# EAGLE schematic control (EAGLE 8.1.1)
Control Board
REVISION: v2.1; TEAM: RoboCup SSL

## Sheet 1 of 5: Microcontroller
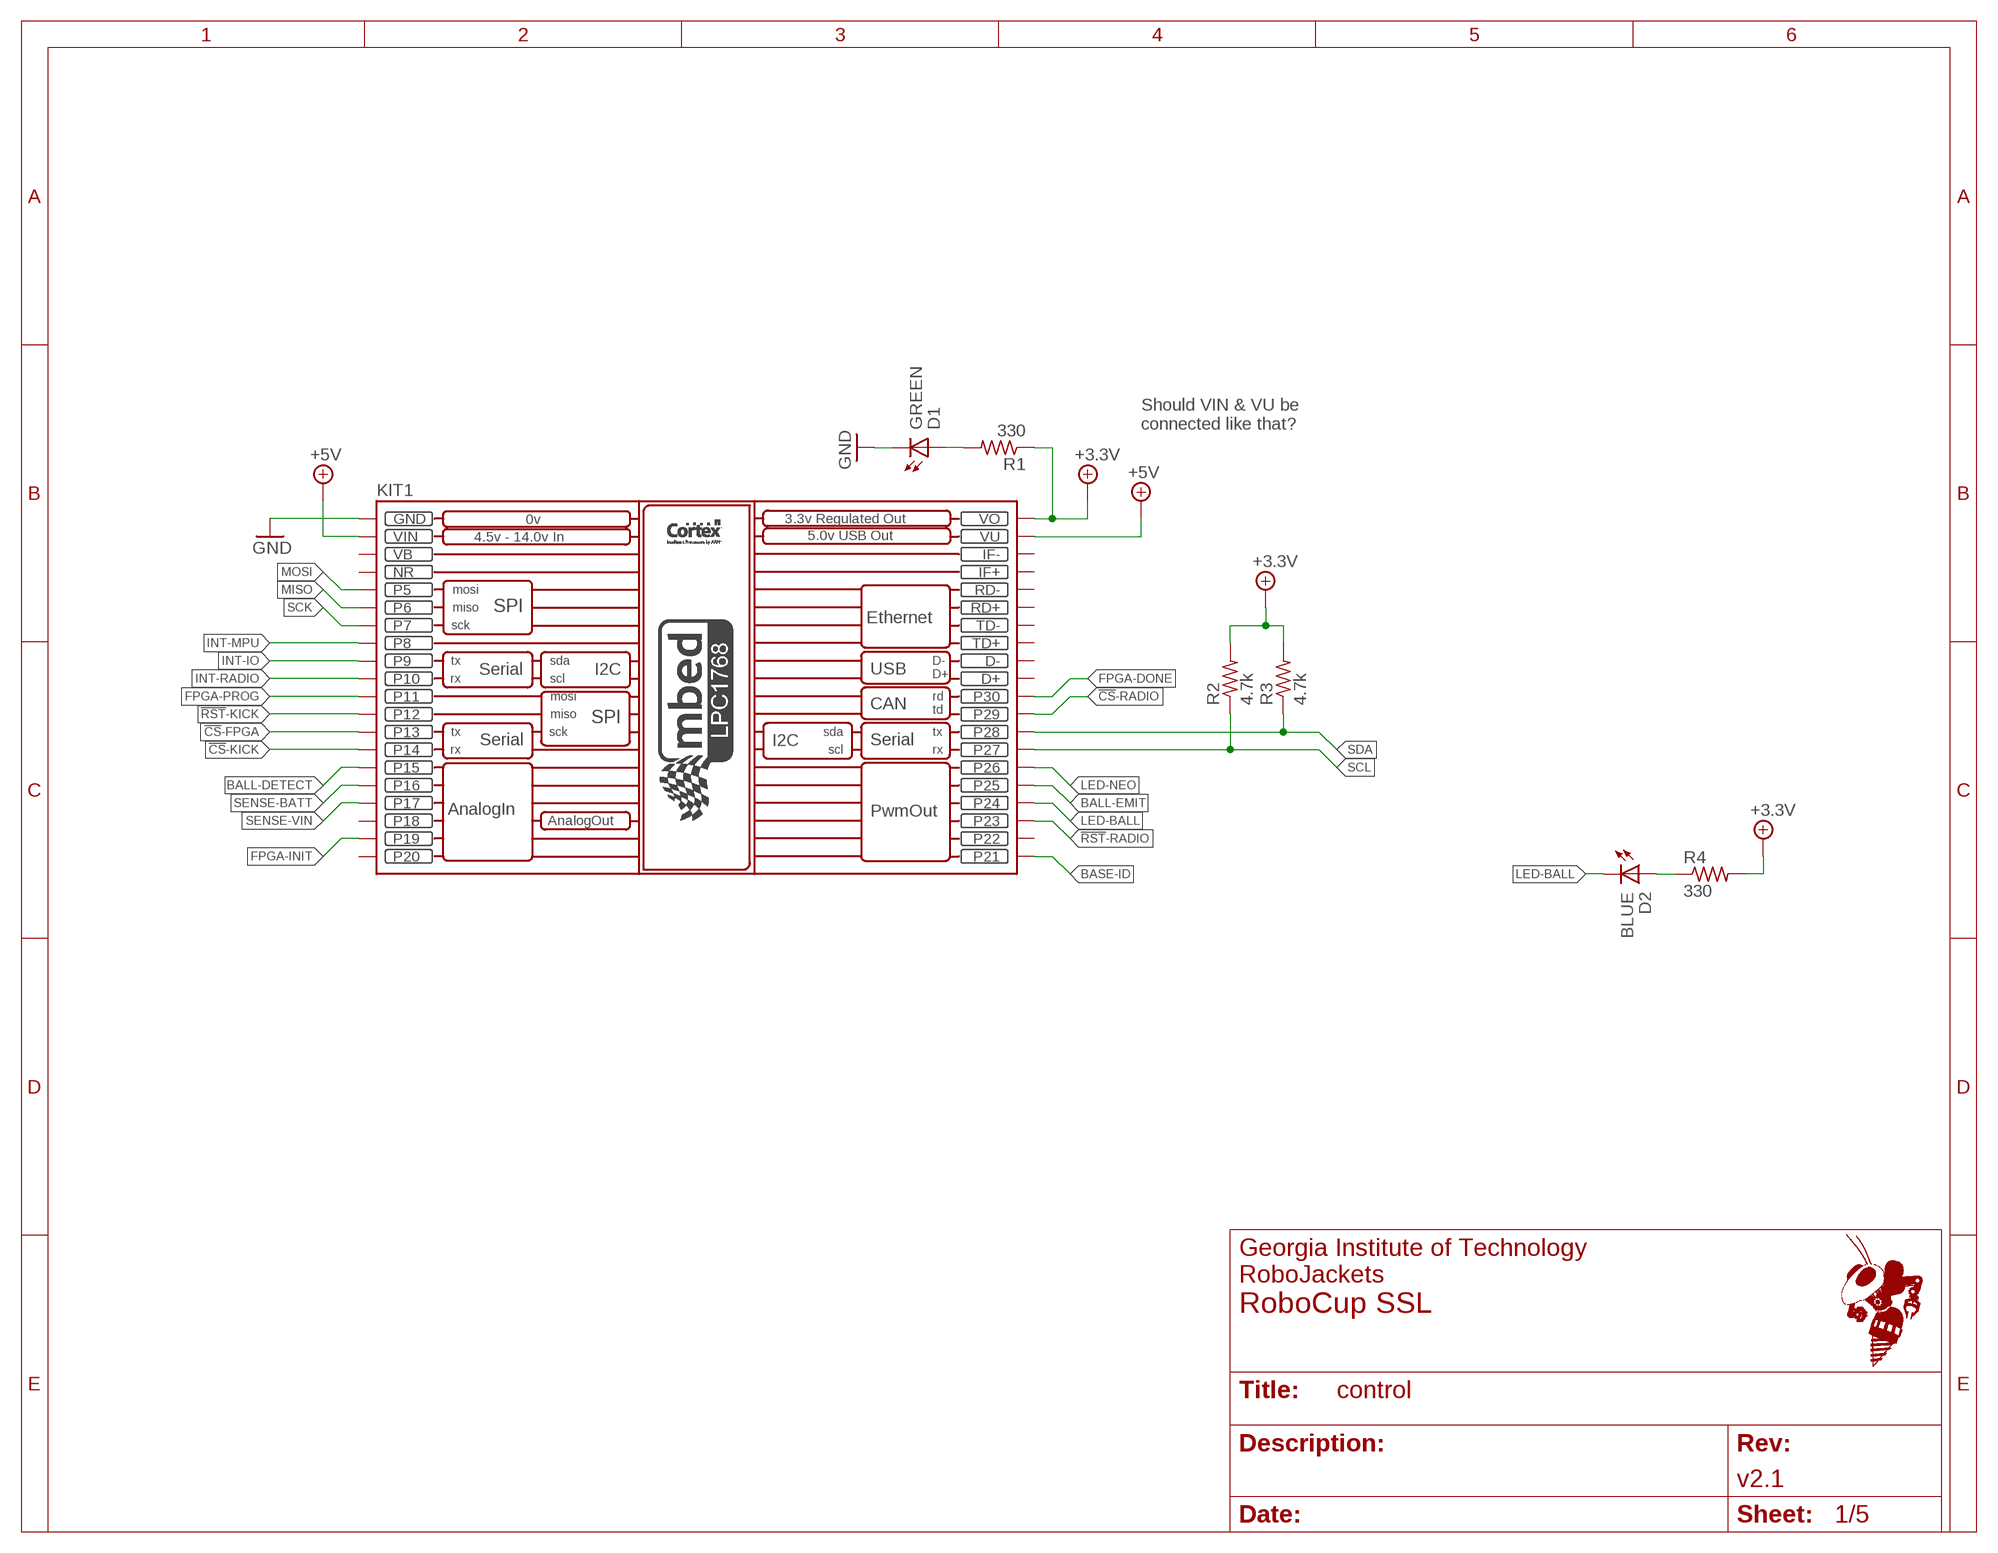
[diagram p0: schematic, sheet 1]
FRAME1 (FRAME_A_L): SCH_DESC: Microcontroller

### Parts
D1  GREEN  LED-SMD-GREEN  [CHIP-LED0603]
D2  BLUE  LED-SMD-BLUE  [CHIP-LED0603]
KIT1  MBED_NXP_LPC1768  [MBED-KIT]
R1  330  R-US_R0603  [R0603]
R2  4.7k  R-US_R0603  [R0603]
R3  4.7k  R-US_R0603  [R0603]
R4  330  R-US_R0603  [R0603]

### Nets
!CS!-FPGA: KIT1.P$13(P13) ; also sheet 2
!CS!-KICK: KIT1.P$14(P14) ; also sheet 3
!CS!-RADIO: KIT1.P$29(P29) ; also sheet 3
!RST!-KICK: KIT1.P$12(P12) ; also sheet 3
!RST!-RADIO: KIT1.P$23(P23) ; also sheet 3
+3.3V: KIT1.VOUT(VO) R1.1 R2.2 R3.2 R4.2 ; also sheet 2,3,4,5
+3.3V-LED: D1.A R1.2
+5V: KIT1.VIN KIT1.VU ; also sheet 3,4,5
BALL-DETECT: KIT1.P$15(P15) ; also sheet 3
BALL-EMIT: KIT1.P$25(P25) ; also sheet 3
BASE-ID: KIT1.P$21(P21)
FPGA-DONE: KIT1.P$30(P30) ; also sheet 2
FPGA-INIT: KIT1.P$19(P19) ; also sheet 2
FPGA-PROG: KIT1.P$11(P11) ; also sheet 2
GND: D1.C(K) KIT1.GND ; also sheet 2,3,4,5
INT-IO: KIT1.P$9(P9) ; also sheet 3
INT-MPU: KIT1.P$8(P8) ; also sheet 3
INT-RADIO: KIT1.P$10(P10) ; also sheet 3
LED-BALL: D2.C(K) KIT1.P$24(P24)
LED-BALL-PRE: D2.A R4.1
LED-NEO: KIT1.P$26(P26) ; also sheet 3
MISO: KIT1.P$6(P6) ; also sheet 2,3
MOSI: KIT1.P$5(P5) ; also sheet 2,3
SCK: KIT1.P$7(P7) ; also sheet 2,3
SCL: KIT1.P$27(P27) R2.1 ; also sheet 3
SDA: KIT1.P$28(P28) R3.1 ; also sheet 3
SENSE-BATT: KIT1.P$16(P16) ; also sheet 3
SENSE-VIN: KIT1.P$17(P17) ; also sheet 3
Unconnected: KIT1.D+ KIT1.D- KIT1.IF+ KIT1.IF- KIT1.NR KIT1.P$18(P18) KIT1.P$20(P20) KIT1.P$22(P22) KIT1.RD+ KIT1.RD- KIT1.TD+ KIT1.TD-

### Notes on the sheet
- Should VIN & VU be
  connected like that?

## Sheet 2 of 5: FPGA
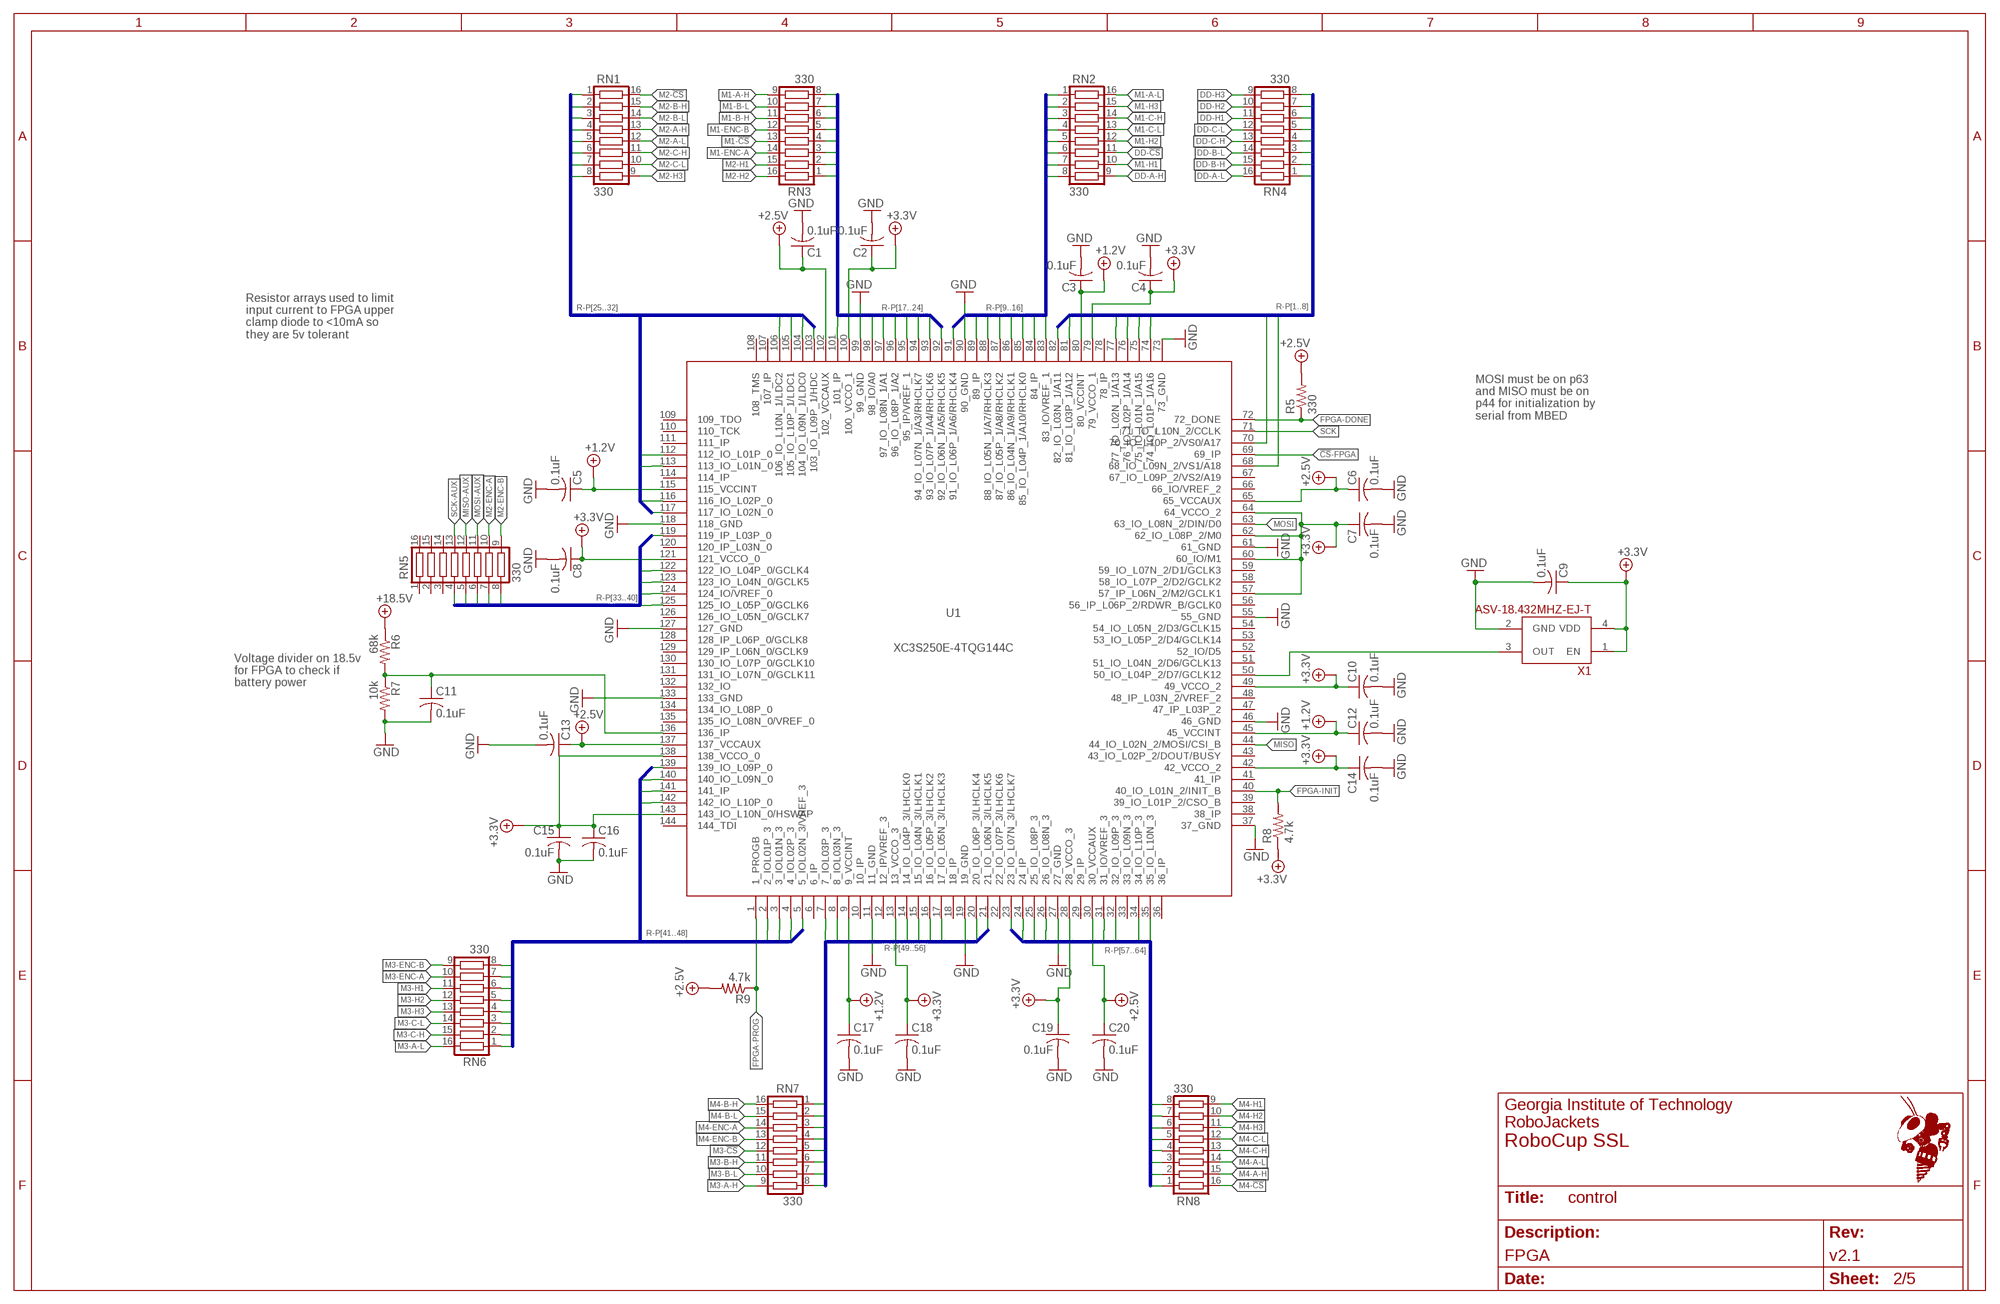
[diagram p1: schematic, sheet 2]
FRAME2 (FRAME_B_L): SCH_DESC: FPGA

### Parts
C1  0.1uF  C-USC0603  [C0603]
C2  0.1uF  C-USC0603  [C0603]
C3  0.1uF  C-USC0603  [C0603]
C4  0.1uF  C-USC0603  [C0603]
C5  0.1uF  C-USC0603  [C0603]
C6  0.1uF  C-USC0603  [C0603]
C7  0.1uF  C-USC0603  [C0603]
C8  0.1uF  C-USC0603  [C0603]
C9  0.1uF  C-USC0603  [C0603]
C10  0.1uF  C-USC0603  [C0603]
C11  0.1uF  C-USC0603  [C0603]
C12  0.1uF  C-USC0603  [C0603]
C13  0.1uF  C-USC0603  [C0603]
C14  0.1uF  C-USC0603  [C0603]
C15  0.1uF  C-USC0603  [C0603]
C16  0.1uF  C-USC0603  [C0603]
C17  0.1uF  C-USC0603  [C0603]
C18  0.1uF  C-USC0603  [C0603]
C19  0.1uF  C-USC0603  [C0603]
C20  0.1uF  C-USC0603  [C0603]
R5  330  R-US_R0603  [R0603]
R6  68k  R-US_R0603  [R0603]
R7  10k  R-US_R0603  [R0603]
R8  4.7k  R-US_R0603  [R0603]
R9  4.7k  R-US_R0603  [R0603]
RN1  330  RA-8  [RA-8_2506]
RN2  330  RA-8  [RA-8_2506]
RN3  330  RA-8  [RA-8_2506]
RN4  330  RA-8  [RA-8_2506]
RN5  330  RA-8  [RA-8_2506]
RN6  330  RA-8  [RA-8_2506]
RN7  330  RA-8  [RA-8_2506]
RN8  330  RA-8  [RA-8_2506]
U1  XC3S250E-4TQG144C  [TQFP144]
X1  ASV-18.432MHZ-EJ-T  [ASV]

### Nets
!CS!-FPGA: U1.69(69_IP) ; also sheet 1
+1.2V: C3.1 C5.1 C12.1 C17.1 U1.9(9_VCCINT) U1.45(45_VCCINT) U1.80(80_VCCINT) U1.115(115_VCCINT) ; also sheet 4
+2.5V: C1.1 C6.1 C13.1 C20.1 R5.2 R9.2 U1.30(30_VCCAUX) U1.65(65_VCCAUX) U1.102(102_VCCAUX) U1.137(137_VCCAUX) ; also sheet 4
+3.3V: C2.1 C4.1 C7.1 C8.1 C9.1 C10.1 C14.1 C15.1 C16.1 C18.1 C19.1 R8.1 U1.13(13_VCCO_3) U1.28(28_VCCO_3) U1.42(42_VCCO_2) U1.49(49_VCCO_2) U1.57(57_IP_L06N_2/M2/GCLK1) U1.60(60_IO/M1) U1.62(62_IO_L08P_2/M0) U1.64(64_VCCO_2) U1.79(79_VCCO_1) U1.100(100_VCCO_1) U1.121(121_VCCO_0) U1.138(138_VCCO_0) U1.143(143_IO_L10N_0/HSWAP) X1.1(EN) X1.4(VDD) ; also sheet 1,3,4,5
+18.5V: R6.1 ; also sheet 3,4,5
BATT-FPGA: C11.1 R6.2 R7.1 U1.136(136_IP)
DD-!CS: RN2.11 ; also sheet 5
DD-A-H: RN2.9 ; also sheet 5
DD-A-L: RN4.16 ; also sheet 5
DD-B-H: RN4.15 ; also sheet 5
DD-B-L: RN4.14 ; also sheet 5
DD-C-H: RN4.13 ; also sheet 5
DD-C-L: RN4.12 ; also sheet 5
DD-H1: RN4.11 ; also sheet 5
DD-H2: RN4.10 ; also sheet 5
DD-H3: RN4.9 ; also sheet 5
FPGA-CLK: U1.50(50_IO_L04P_2/D7/GCLK12) X1.3(OUT)
FPGA-DONE: R5.1 U1.72(72_DONE) ; also sheet 1
FPGA-INIT: R8.2 U1.40(40_IO_L01N_2/INIT_B) ; also sheet 1
FPGA-PROG: R9.1 U1.1(1_PROGB) ; also sheet 1
GND: C1.2 C2.2 C3.2 C4.2 C5.2 C6.2 C7.2 C8.2 C9.2 C10.2 C11.2 C12.2 C13.2 C14.2 C15.2 C16.2 C17.2 C18.2 C19.2 C20.2 R7.2 U1.11(11_GND) U1.19(19_GND) U1.27(27_GND) U1.37(37_GND) U1.46(46_GND) U1.55(55_GND) U1.61(61_GND) U1.73(73_GND) U1.90(90_GND) U1.99(99_GND) U1.118(118_GND) U1.127(127_GND) U1.133(133_GND) X1.2(GND) ; also sheet 1,3,4,5
M1-!CS: RN3.13 ; also sheet 5
M1-A-H: RN3.9 ; also sheet 5
M1-A-L: RN2.16 ; also sheet 5
M1-B-H: RN3.11 ; also sheet 5
M1-B-L: RN3.10 ; also sheet 5
M1-C-H: RN2.14 ; also sheet 5
M1-C-L: RN2.13 ; also sheet 5
M1-ENC-A: RN3.14 ; also sheet 5
M1-ENC-B: RN3.12 ; also sheet 5
M1-H1: RN2.10 ; also sheet 5
M1-H2: RN2.12 ; also sheet 5
M1-H3: RN2.15 ; also sheet 5
M2-!CS: RN1.16 ; also sheet 5
M2-A-H: RN1.13 ; also sheet 5
M2-A-L: RN1.12 ; also sheet 5
M2-B-H: RN1.15 ; also sheet 5
M2-B-L: RN1.14 ; also sheet 5
M2-C-H: RN1.11 ; also sheet 5
M2-C-L: RN1.10 ; also sheet 5
M2-ENC-A: RN5.10 ; also sheet 5
M2-ENC-B: RN5.9 ; also sheet 5
M2-H1: RN3.15 ; also sheet 5
M2-H2: RN3.16 ; also sheet 5
M2-H3: RN1.9 ; also sheet 5
M3-!CS: RN7.12 ; also sheet 5
M3-A-H: RN7.9 ; also sheet 5
M3-A-L: RN6.16 ; also sheet 5
M3-B-H: RN7.11 ; also sheet 5
M3-B-L: RN7.10 ; also sheet 5
M3-C-H: RN6.15 ; also sheet 5
M3-C-L: RN6.14 ; also sheet 5
M3-ENC-A: RN6.10 ; also sheet 5
M3-ENC-B: RN6.9 ; also sheet 5
M3-H1: RN6.11 ; also sheet 5
M3-H2: RN6.12 ; also sheet 5
M3-H3: RN6.13 ; also sheet 5
M4-!CS: RN8.16 ; also sheet 5
M4-A-H: RN8.15 ; also sheet 5
M4-A-L: RN8.14 ; also sheet 5
M4-B-H: RN7.16 ; also sheet 5
M4-B-L: RN7.15 ; also sheet 5
M4-C-H: RN8.13 ; also sheet 5
M4-C-L: RN8.12 ; also sheet 5
M4-ENC-A: RN7.14 ; also sheet 5
M4-ENC-B: RN7.13 ; also sheet 5
M4-H1: RN8.9 ; also sheet 5
M4-H2: RN8.10 ; also sheet 5
M4-H3: RN8.11 ; also sheet 5
MISO: U1.44(44_IO_L02N_2/MOSI/CSI_B) ; also sheet 1,3
MISO-AUX: RN5.12 ; also sheet 5
MOSI: U1.63(63_IO_L08N_2/DIN/D0) ; also sheet 1,3
MOSI-AUX: RN5.11 ; also sheet 5
R-P1: RN4.1 U1.82(82_IO_L03N_1/A11)
R-P2: RN4.2 U1.81(81_IO_L03P_1/A12)
R-P3: RN4.3 U1.77(77_IO_L02N_1/A13)
R-P4: RN4.4 U1.76(76_IO_L02P_1/A14)
R-P5: RN4.5 U1.75(75_IO_L01N_1/A15)
R-P6: RN4.6 U1.74(74_IO_L01P_1/A16)
R-P7: RN4.7 U1.70(70_IO_L10P_2/VS0/A17)
R-P8: RN4.8 U1.68(68_IO_L09N_2/VS1/A18)
R-P9: RN2.1 U1.91(91_IO_L06P_1/A6/RHCLK4)
R-P10: RN2.2 U1.89(89_IP)
R-P11: RN2.3 U1.88(88_IO_L05N_1/A7/RHCLK3)
R-P12: RN2.4 U1.87(87_IO_L05P_1/A8/RHCLK2)
R-P13: RN2.5 U1.86(86_IO_L04N_1/A9/RHCLK1)
R-P14: RN2.6 U1.85(85_IO_L04P_1/A10/RHCLK0)
R-P15: RN2.7 U1.84(84_IP)
R-P16: RN2.8 U1.83(83_IO/VREF_1)
R-P17: RN3.1 U1.101(101_IP)
R-P18: RN3.2 U1.98(98_IO/A0)
R-P19: RN3.3 U1.97(97_IO_L08N_1/A1)
R-P20: RN3.4 U1.96(96_IO_L08P_1/A2)
R-P21: RN3.5 U1.95(95_IP/VREF_1)
R-P22: RN3.6 U1.94(94_IO_L07N_1/A3/RHCLK7)
R-P23: RN3.7 U1.93(93_IO_L07P_1/A4/RHCLK6)
R-P24: RN3.8 U1.92(92_IO_L06N_1/A5/RHCLK5)
R-P25: RN1.1 U1.117(117_IO_L02N_0)
R-P26: RN1.2 U1.116(116_IO_L02P_0)
R-P27: RN1.3 U1.113(113_IO_L01N_0)
R-P28: RN1.4 U1.112(112_IO_L01P_0)
R-P29: RN1.5 U1.106(106_IO_L10N_1/LDC2)
R-P30: RN1.6 U1.105(105_IO_L10P_1/LDC1)
R-P31: RN1.7 U1.104(104_IO_L09N_1/LDC0)
R-P32: RN1.8 U1.103(103_IO_L09P_1/HDC)
R-P36: RN5.4 U1.125(125_IO_L05P_0/GCLK6)
R-P37: RN5.5 U1.124(124_IO/VREF_0)
R-P38: RN5.6 U1.123(123_IO_L04N_0/GCLK5)
R-P39: RN5.7 U1.122(122_IO_L04P_0/GCLK4)
R-P40: RN5.8 U1.119(119_IP_L03P_0)
R-P41: RN6.1 U1.5(5_IOL02N_3/VREF_3)
R-P42: RN6.2 U1.4(4_IOL02P_3)
R-P43: RN6.3 U1.3(3_IOL01N_3)
R-P44: RN6.4 U1.2(2_IOL01P_3)
R-P45: RN6.5 U1.142(142_IO_L10P_0)
R-P46: RN6.6 U1.141(141_IP)
R-P47: RN6.7 U1.140(140_IO_L09N_0)
R-P48: RN6.8 U1.139(139_IO_L09P_0)
R-P49: RN7.1 U1.21(21_IO_L06N_3/LHCLK5)
R-P50: RN7.2 U1.20(20_IO_L06P_3/LHCLK4)
R-P51: RN7.3 U1.17(17_IO_L05N_3/LHCLK3)
R-P52: RN7.4 U1.16(16_IO_L05P_3/LHCLK2)
R-P53: RN7.5 U1.15(15_IO_L04N_3/LHCLK1)
R-P54: RN7.6 U1.14(14_IO_L04P_3/LHCLK0)
R-P55: RN7.7 U1.8(8_IOL03N_3)
R-P56: RN7.8 U1.7(7_IOL03P_3)
R-P57: RN8.1 U1.35(35_IO_L10N_3)
R-P58: RN8.2 U1.34(34_IO_L10P_3)
R-P59: RN8.3 U1.32(32_IO_L09P_3)
R-P60: RN8.4 U1.31(31_IO/VREF_3)
R-P61: RN8.5 U1.26(26_IO_L08N_3)
R-P62: RN8.6 U1.25(25_IO_L08P_3)
R-P63: RN8.7 U1.24(24_IP)
R-P64: RN8.8 U1.23(23_IO_L07N_3/LHCLK7)
SCK: U1.71(71_IO_L10N_2/CCLK) ; also sheet 1,3
SCK-AUX: RN5.13 ; also sheet 5
Unconnected: RN5.1 RN5.2 RN5.3 RN5.14 RN5.15 RN5.16 U1.6(6_IP) U1.10(10_IP) U1.12(12_IP/VREF_3) U1.18(18_IP) U1.22(22_IO_L07P_3/LHCLK6) U1.29(29_IP) U1.33(33_IO_L09N_3) U1.36(36_IP) U1.38(38_IP) U1.39(39_IO_L01P_2/CSO_B) U1.41(41_IP) U1.43(43_IO_L02P_2/DOUT/BUSY) U1.47(47_IP_L03P_2) U1.48(48_IP_L03N_2/VREF_2) U1.51(51_IO_L04N_2/D6/GCLK13) U1.52(52_IO/D5) U1.53(53_IO_L05P_2/D4/GCLK14) U1.54(54_IO_L05N_2/D3/GCLK15) U1.56(56_IP_L06P_2/RDWR_B/GCLK0) U1.58(58_IO_L07P_2/D2/GCLK2) U1.59(59_IO_L07N_2/D1/GCLK3) U1.66(66_IO/VREF_2) U1.67(67_IO_L09P_2/VS2/A19) U1.78(78_IP) U1.107(107_IP) U1.108(108_TMS) U1.109(109_TDO) U1.110(110_TCK) U1.111(111_IP) U1.114(114_IP) U1.120(120_IP_L03N_0) U1.126(126_IO_L05N_0/GCLK7) U1.128(128_IP_L06P_0/GCLK8) U1.129(129_IP_L06N_0/GCLK9) U1.130(130_IO_L07P_0/GCLK10) U1.131(131_IO_L07N_0/GCLK11) U1.132(132_IO) U1.134(134_IO_L08P_0) U1.135(135_IO_L08N_0/VREF_0) U1.144(144_TDI)

### Buses
R-P[1..8]
R-P[9..16]
R-P[17..24]
R-P[25..32]
R-P[33..40]
R-P[49..56]
R-P[57..64]
R-P[41..48]

### Notes on the sheet
- Resistor arrays used to limit
  input current to FPGA upper
  clamp diode to <10mA so
  they are 5v tolerant
- MOSI must be on p63
  and MISO must be on
  p44 for initialization by
  serial from MBED
- Voltage divider on 18.5v
  for FPGA to check if 
  battery power

## Sheet 3 of 5: Misc
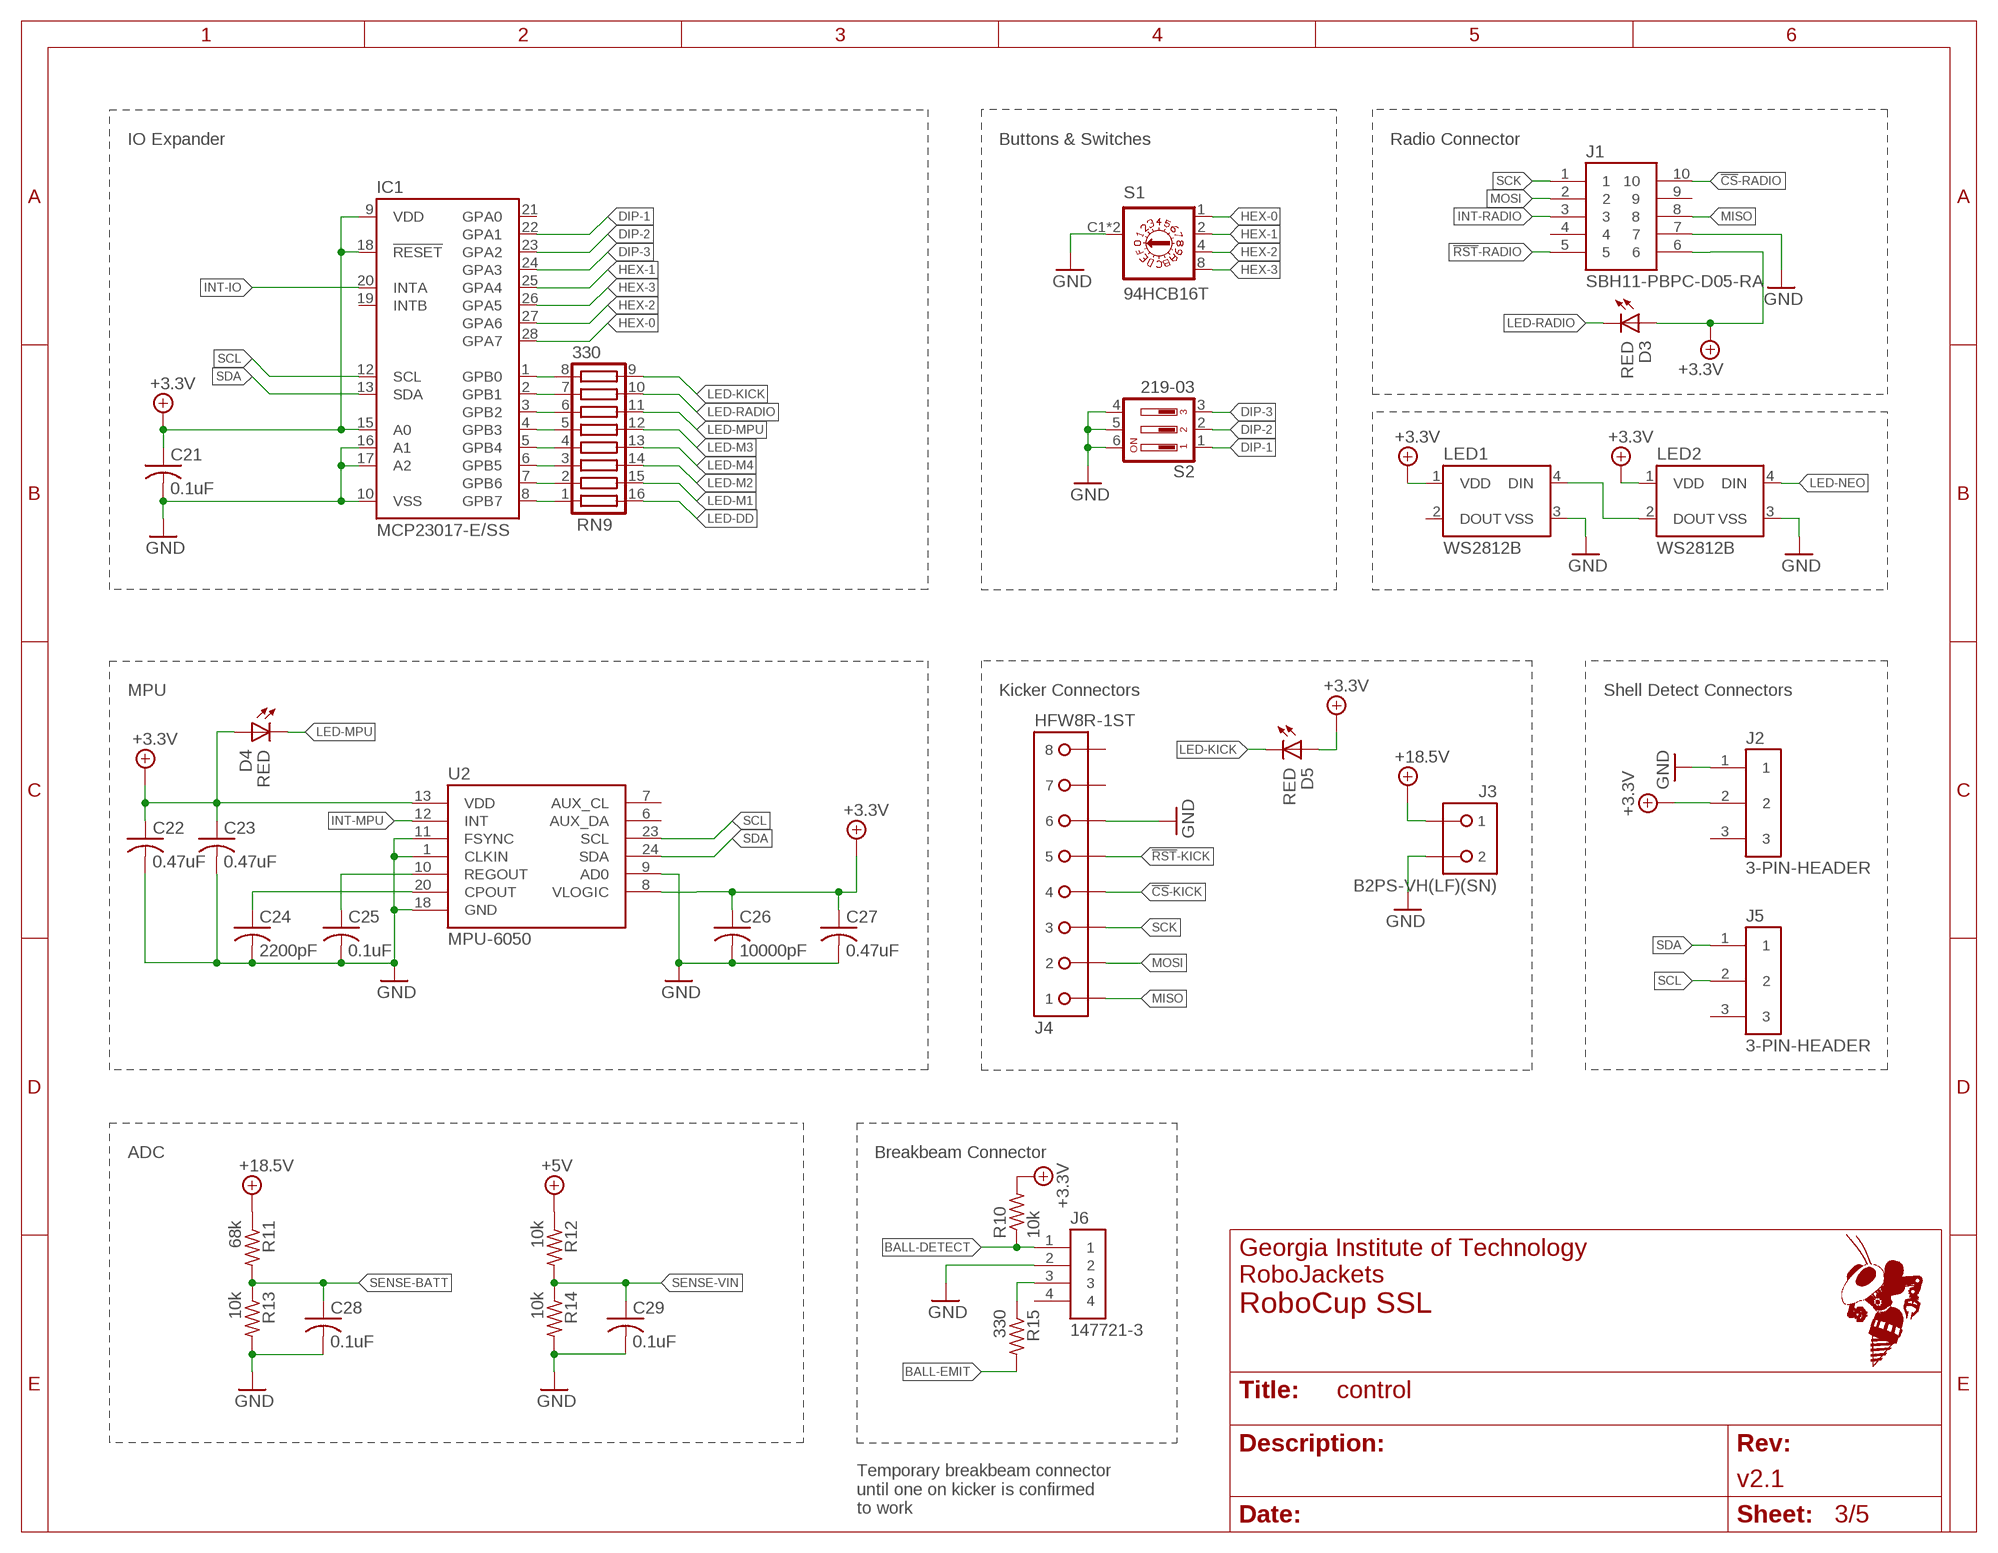
[diagram p2: schematic, sheet 3]
FRAME3 (FRAME_A_L): SCH_DESC: Misc ICs, Buttons, Connectors

### Parts
C21  0.1uF  C-USC0603  [C0603]
C22  0.47uF  C-USC0603  [C0603]
C23  0.47uF  C-USC0603  [C0603]
C24  2200pF  C-USC0603  [C0603]
C25  0.1uF  C-USC0603  [C0603]
C26  10000pF  C-USC0603  [C0603]
C27  0.47uF  C-USC0603  [C0603]
C28  0.1uF  C-USC0603  [C0603]
C29  0.1uF  C-USC0603  [C0603]
D3  RED  LED-SMD-RED  [CHIP-LED0603]
D4  RED  LED-SMD-RED  [CHIP-LED0603]
D5  RED  LED-SMD-RED  [CHIP-LED0603]
IC1  MCP23017-E/SS  [SSOP-28]
J1  SBH11-PBPC-D05-RA  [SBH11-*-D05-RA]
J2  3-PIN-HEADER  [3-PIN-HEADER]
J3  B2PS-VH(LF)(SN)  [B2PS-CENTERED]
J4  HFW8R-1ST  [HFW8R-1ST]
J5  3-PIN-HEADER  [3-PIN-HEADER]
J6  147721-3  [147721-3]
LED1  WS2812B  [5050]
LED2  WS2812B  [5050]
R10  10k  R-US_R0603  [R0603]
R11  68k  R-US_R0603  [R0603]
R12  10k  R-US_R0603  [R0603]
R13  10k  R-US_R0603  [R0603]
R14  10k  R-US_R0603  [R0603]
R15  330  R-US_R0603  [R0603]
RN9  330  RA-8  [RA-8_2506]
S1  94HCB16T  [HEX]
S2  219-03  [CTS-219-03]
U2  MPU-6050  [QFN-24-4MM2]

### Nets
!CS!-KICK: J4.4 ; also sheet 1
!CS!-RADIO: J1.10 ; also sheet 1
!RST!-KICK: J4.5 ; also sheet 1
!RST!-RADIO: J1.5 ; also sheet 1
+3.3V: C21.1 C22.1 C23.1 C26.1 C27.1 D3.A D4.A D5.A IC1.9(VDD) IC1.15(A0) IC1.18(!RESET) J1.6 J2.2 LED1.1(VDD) LED2.1(VDD) R10.2 U2.8(VLOGIC) U2.13(VDD) ; also sheet 1,2,4,5
+5V: R12.1 ; also sheet 1,4,5
+18.5V: J3.1 R11.1 ; also sheet 2,4,5
BALL-DETECT: J6.1 R10.1 ; also sheet 1
BALL-EMIT: R15.2 ; also sheet 1
BALL-EMIT-PRE: J6.3 R15.1
CPOUT: C24.1 U2.20(CPOUT)
DIP-1: IC1.22(GPA1) S2.1
DIP-2: IC1.23(GPA2) S2.2
DIP-3: IC1.24(GPA3) S2.3
GND: C21.2 C22.2 C23.2 C24.2 C25.2 C26.2 C27.2 C28.2 C29.2 IC1.10(VSS) IC1.16(A1) IC1.17(A2) J1.7 J2.1 J3.2 J4.6 J6.2 LED1.3(VSS) LED2.3(VSS) R13.2 R14.2 S1.C1(C) S1.C2(C) S2.4 S2.5 S2.6 U2.1(CLKIN) U2.9(AD0) U2.11(FSYNC) U2.18(GND) ; also sheet 1,2,4,5
GPB0: IC1.1(GPB0) RN9.8
GPB1: IC1.2(GPB1) RN9.7
GPB2: IC1.3(GPB2) RN9.6
GPB3: IC1.4(GPB3) RN9.5
GPB4: IC1.5(GPB4) RN9.4
GPB5: IC1.6(GPB5) RN9.3
GPB6: IC1.7(GPB6) RN9.2
GPB7: IC1.8(GPB7) RN9.1
HEX-0: IC1.28(GPA7) S1.1
HEX-1: IC1.25(GPA4) S1.2
HEX-2: IC1.27(GPA6) S1.4
HEX-3: IC1.26(GPA5) S1.8
INT-IO: IC1.20(INTA) ; also sheet 1
INT-MPU: U2.12(INT) ; also sheet 1
INT-RADIO: J1.3 ; also sheet 1
LED-DD: RN9.16 ; also sheet 5
LED-KICK: D5.C(K) RN9.9
LED-M1: RN9.15 ; also sheet 5
LED-M2: RN9.14 ; also sheet 5
LED-M3: RN9.12 ; also sheet 5
LED-M4: RN9.13 ; also sheet 5
LED-MPU: D4.C(K) RN9.11
LED-NEO: LED2.4(DIN) ; also sheet 1
LED-RADIO: D3.C(K) RN9.10
MISO: J1.8 J4.1 ; also sheet 1,2
MOSI: J1.2 J4.2 ; also sheet 1,2
NEO-IO: LED1.4(DIN) LED2.2(DOUT)
REGOUT: C25.1 U2.10(REGOUT)
SCK: J1.1 J4.3 ; also sheet 1,2
SCL: IC1.12(SCL) J5.2 U2.23(SCL) ; also sheet 1
SDA: IC1.13(SDA) J5.1 U2.24(SDA) ; also sheet 1
SENSE-BATT: C28.1 R11.2 R13.1 ; also sheet 1
SENSE-VIN: C29.1 R12.2 R14.1 ; also sheet 1
Unconnected: IC1.19(INTB) IC1.21(GPA0) J1.4 J1.9 J2.3 J4.7 J4.8 J4.LEG1 J4.LEG2 J5.3 J6.4 LED1.2(DOUT) U2.6(AUX_DA) U2.7(AUX_CL)

### Notes on the sheet
- IO Expander | Buttons & Switches | Radio Connector
- MPU | Kicker Connectors | Shell Detect Connectors
- ADC | Breakbeam Connector
- Temporary breakbeam connector
  until one on kicker is confirmed
  to work

## Sheet 4 of 5: Power
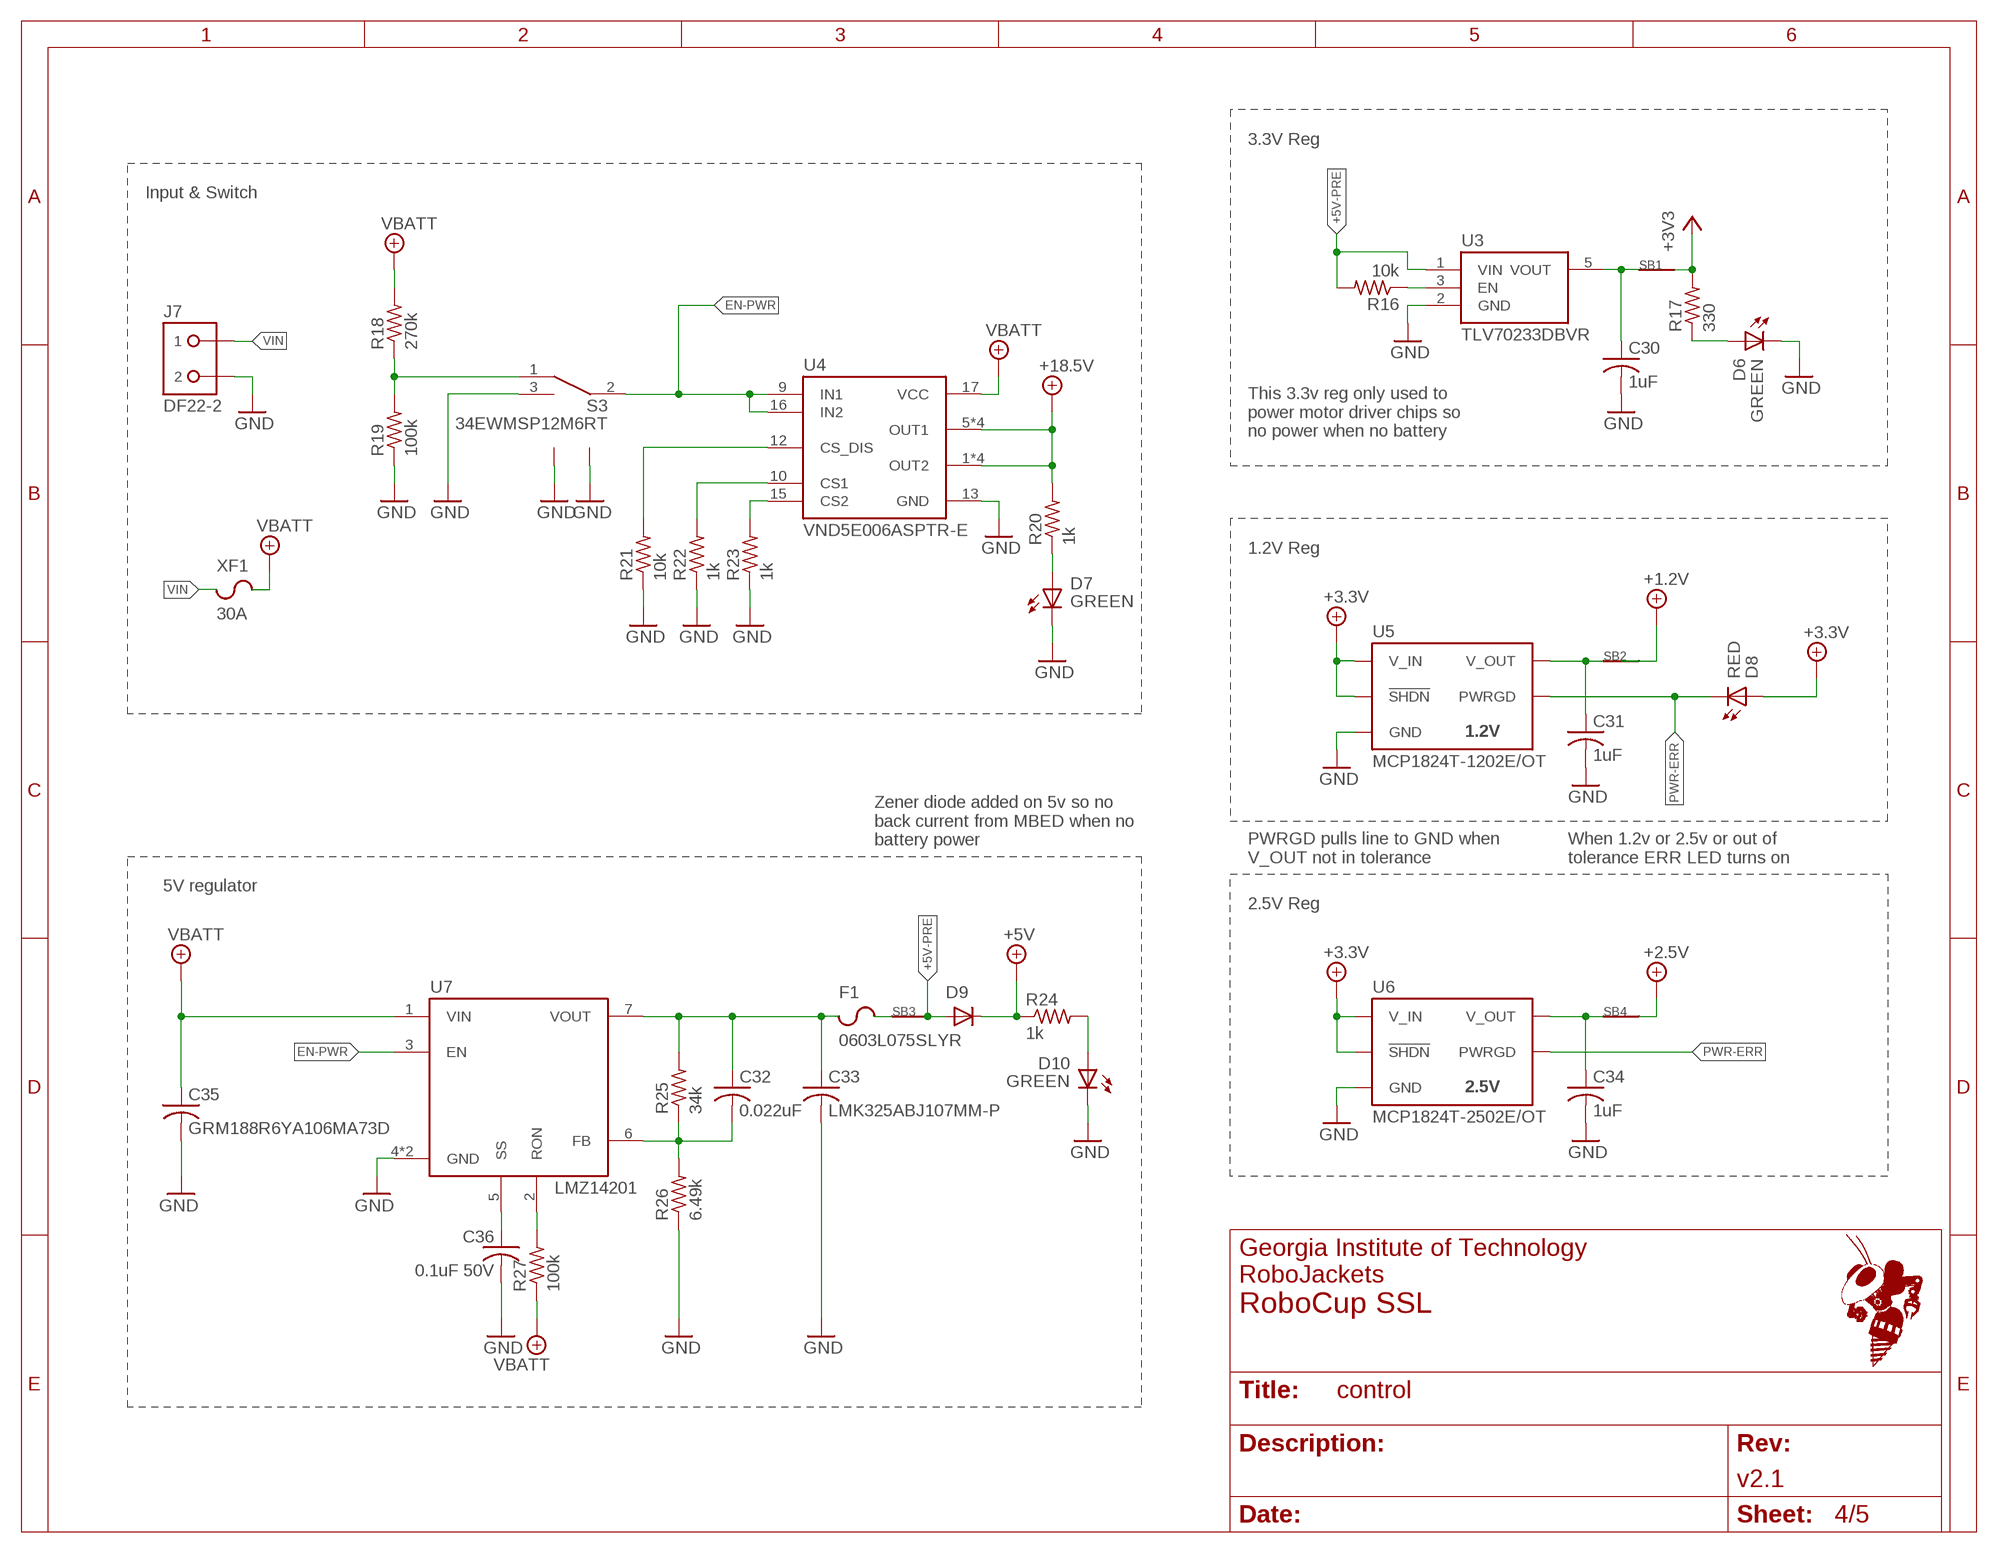
[diagram p3: schematic, sheet 4]

### Parts
C30  1uF  C-USC0603  [C0603]
C31  1uF  C-USC0603  [C0603]
C32  0.022uF  C-USC0603  [C0603]
C33  LMK325ABJ107MM-P  C-USC1210  [C1210]
C34  1uF  C-USC0603  [C0603]
C35  GRM188R6YA106MA73D  C-USC0603  [C0603]
C36  0.1uF 50V  C-USC0603  [C0603]
D6  GREEN  LED-SMD-GREEN  [CHIP-LED0603]
D7  GREEN  LED-SMD-GREEN  [CHIP-LED0603]
D8  RED  LED-SMD-RED  [CHIP-LED0603]
D9  DIODE-SOD123  [SOD123]
D10  GREEN  LED-SMD-GREEN  [CHIP-LED0603]
F1  0603L075SLYR  CHIP_FUSE0603  [F0603]
J7  DF22-2  [DF22-2-H]
R16  10k  R-US_R0603  [R0603]
R17  330  R-US_R0603  [R0603]
R18  270k  R-US_R0603  [R0603]
R19  100k  R-US_R0603  [R0603]
R20  1k  R-US_R0603  [R0603]
R21  10k  R-US_R0603  [R0603]
R22  1k  R-US_R0603  [R0603]
R23  1k  R-US_R0603  [R0603]
R24  1k  R-US_R0603  [R0603]
R25  34k  R-US_R0603  [R0603]
R26  6.49k  R-US_R0603  [R0603]
R27  100k  R-US_R0603  [R0603]
S3  34EWMSP12M6RT  [34EWMSP12M6RT]
SB1  SOLDERBRIDGESB0603  [SB0603]
SB2  SOLDERBRIDGESB0603  [SB0603]
SB3  SOLDERBRIDGESB0603  [SB0603]
SB4  SOLDERBRIDGESB0603  [SB0603]
U3  TLV70233DBVR  [SOT-23-5]
U4  VND5E006ASPTR-E  [POWERSO-16]
U5  MCP1824T-1202E/OT  [SOT-23-5]
U6  MCP1824T-2502E/OT  [SOT-23-5]
U7  LMZ14201  [TO-PMOD-7]
XF1  30A  3557-2  [3557-2]

### Nets
3.3V-EN: R16.1 U3.3(EN)
3V3-LED: D6.A R17.1
5V-LED: D10.A R24.2
18.5V-LED: D7.A R20.1
+1.2V: SB2.2 ; also sheet 2
+1.2V-PRE: C31.1 SB2.1 U5.5(V_OUT)
+2.5V: SB4.2 ; also sheet 2
+2.5V-PRE: C34.1 SB4.1 U6.5(V_OUT)
+3.3V: D8.A U5.1(V_IN) U5.3(!SHDN) U6.1(V_IN) U6.3(!SHDN) ; also sheet 1,2,3,5
+3V3: R17.2 SB1.2 ; also sheet 5
+3V3-PRE: C30.1 SB1.1 U3.5(VOUT)
+5V: D9.C R24.1 ; also sheet 1,3,5
+5V-FUSE: C32.1 C33.1 F1.1 R25.2 U7.7(VOUT)
+5V-PRE: D9.A R16.2 SB3.2 U3.1(VIN)
+5V-PRE2: F1.2 SB3.1
+18.5V: R20.2 U4.1(OUT2) U4.2(OUT2) U4.3(OUT2) U4.4(OUT2) U4.5(OUT1) U4.6(OUT1) U4.7(OUT1) U4.8(OUT1) ; also sheet 2,3,5
CS1: R22.2 U4.10(CS1)
CS2: R23.2 U4.15(CS2)
CS-DIS: R21.2 U4.12(CS_DIS)
EN-PWR: S3.2(COMMON) U4.9(IN1) U4.16(IN2) U7.3(EN)
EN-PWR-PRE: R18.1 R19.2 S3.1(A)
FB: C32.2 R25.1 R26.2 U7.6(FB)
GND: C30.2 C31.2 C33.2 C34.2 C35.2 C36.2 D6.C(K) D7.C(K) D10.C(K) J7.2 R19.1 R21.1 R22.1 R23.1 R26.1 S3.3(B) S3.LEG1 S3.LEG3(LEG2) U3.2(GND) U4.13(GND) U5.2(GND) U6.2(GND) U7.4(GND) U7.PAD(GND) ; also sheet 1,2,3,5
PWR-ERR: D8.C(K) U5.4(PWRGD) U6.4(PWRGD)
RON: R27.2 U7.2(RON)
SS: C36.1 U7.5(SS)
VBATT: C35.1 R18.2 R27.1 U4.17(VCC) U7.1(VIN) XF1.3 XF1.4
VIN: J7.1 XF1.1 XF1.2

### Notes on the sheet
- 3.3V Reg
- Input & Switch
- This 3.3v reg only used to
  power motor driver chips so
  no power when no battery
- 1.2V Reg
- Zener diode added on 5v so no
  back current from MBED when no
  battery power
- PWRGD pulls line to GND when
  V_OUT not in tolerance
- When 1.2v or 2.5v or out of
  tolerance ERR LED turns on
- 5V regulator
- 2.5V Reg

## Sheet 5 of 5: Motor Drive
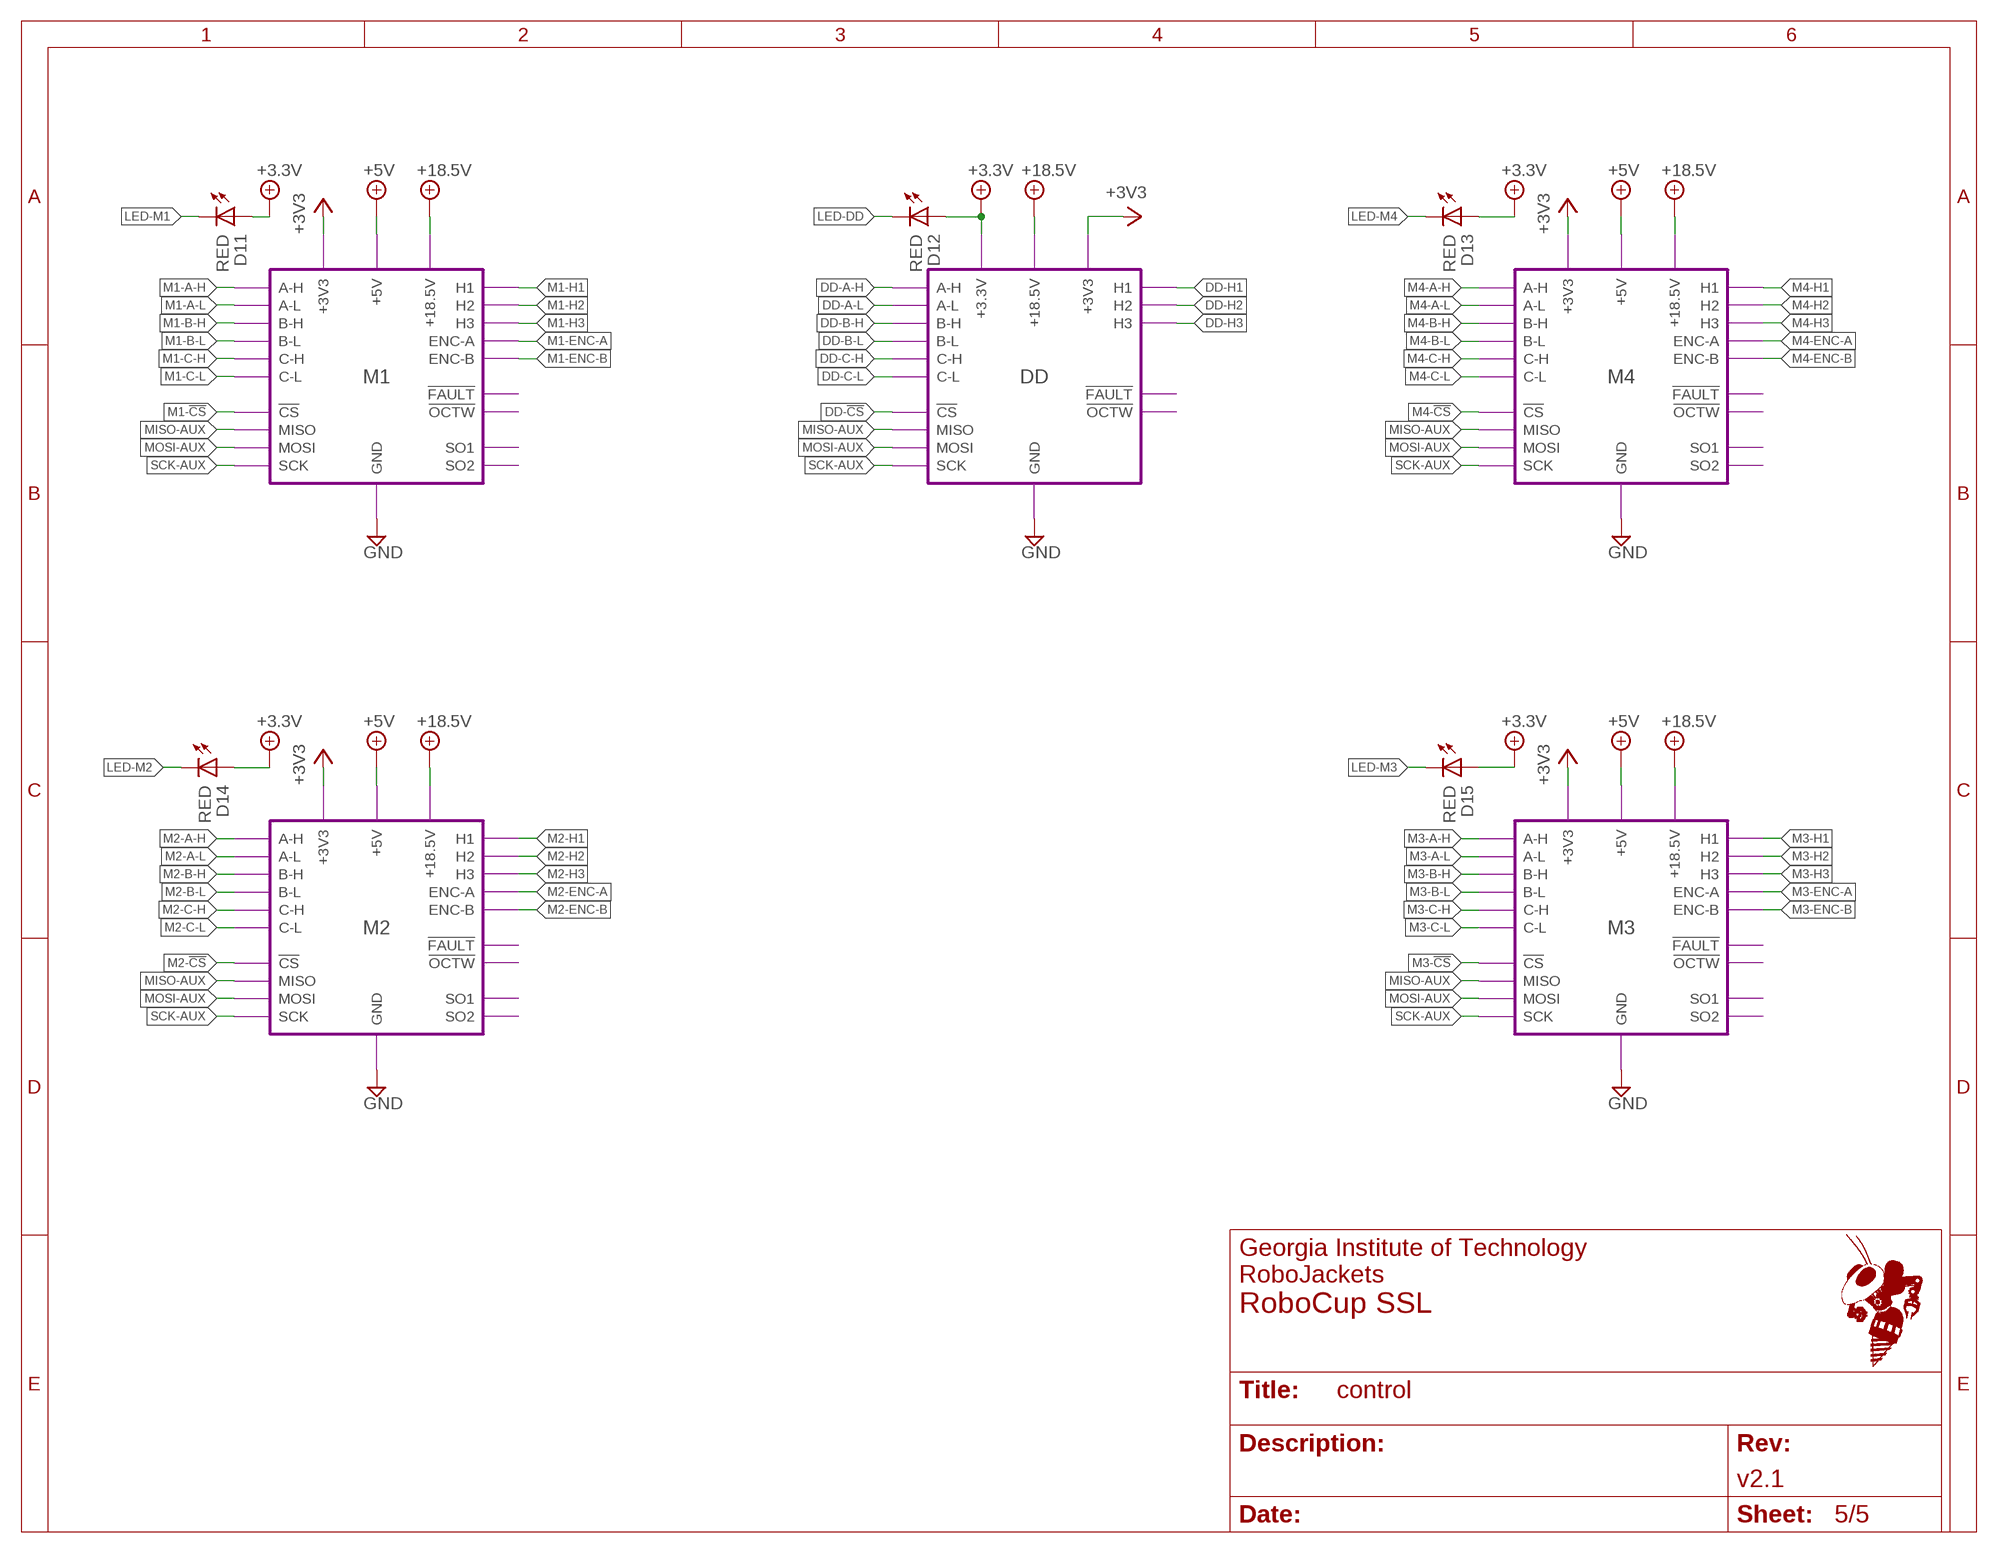
[diagram p4: schematic, sheet 5]

### Parts
D11  RED  LED-SMD-RED  [CHIP-LED0603]
D12  RED  LED-SMD-RED  [CHIP-LED0603]
D13  RED  LED-SMD-RED  [CHIP-LED0603]
D14  RED  LED-SMD-RED  [CHIP-LED0603]
D15  RED  LED-SMD-RED  [CHIP-LED0603]

### Module instances
M1 = WHEEL_DRIVE
M2 = WHEEL_DRIVE
M3 = WHEEL_DRIVE
M4 = WHEEL_DRIVE
DD = DRIBBLER_DRIVE

### Nets
+3.3V: D11.A D12.A D13.A D14.A D15.A ; port DD.+3.3V ; also sheet 1,2,3,4
+3V3: port DD.+3V3 M2.+3V3 M3.+3V3 M4.+3V3 M1.+3V3 ; also sheet 4
+5V: port M1.+5V M2.+5V M3.+5V M4.+5V ; also sheet 1,3,4
+18.5V: port M1.+18.5V M4.+18.5V M2.+18.5V M3.+18.5V DD.+18.5V ; also sheet 2,3,4
DD-!CS: port DD.!CS ; also sheet 2
DD-A-H: port DD.A-H ; also sheet 2
DD-A-L: port DD.A-L ; also sheet 2
DD-B-H: port DD.B-H ; also sheet 2
DD-B-L: port DD.B-L ; also sheet 2
DD-C-H: port DD.C-H ; also sheet 2
DD-C-L: port DD.C-L ; also sheet 2
DD-H1: port DD.H1 ; also sheet 2
DD-H2: port DD.H2 ; also sheet 2
DD-H3: port DD.H3 ; also sheet 2
GND: port M1.GND M4.GND M3.GND M2.GND DD.GND ; also sheet 1,2,3,4
LED-DD: D12.C(K) ; also sheet 3
LED-M1: D11.C(K) ; also sheet 3
LED-M2: D14.C(K) ; also sheet 3
LED-M3: D15.C(K) ; also sheet 3
LED-M4: D13.C(K) ; also sheet 3
M1-!CS: port M1.!CS ; also sheet 2
M1-A-H: port M1.A-H ; also sheet 2
M1-A-L: port M1.A-L ; also sheet 2
M1-B-H: port M1.B-H ; also sheet 2
M1-B-L: port M1.B-L ; also sheet 2
M1-C-H: port M1.C-H ; also sheet 2
M1-C-L: port M1.C-L ; also sheet 2
M1-ENC-A: port M1.ENC-A ; also sheet 2
M1-ENC-B: port M1.ENC-B ; also sheet 2
M1-H1: port M1.H1 ; also sheet 2
M1-H2: port M1.H2 ; also sheet 2
M1-H3: port M1.H3 ; also sheet 2
M2-!CS: port M2.!CS ; also sheet 2
M2-A-H: port M2.A-H ; also sheet 2
M2-A-L: port M2.A-L ; also sheet 2
M2-B-H: port M2.B-H ; also sheet 2
M2-B-L: port M2.B-L ; also sheet 2
M2-C-H: port M2.C-H ; also sheet 2
M2-C-L: port M2.C-L ; also sheet 2
M2-ENC-A: port M2.ENC-A ; also sheet 2
M2-ENC-B: port M2.ENC-B ; also sheet 2
M2-H1: port M2.H1 ; also sheet 2
M2-H2: port M2.H2 ; also sheet 2
M2-H3: port M2.H3 ; also sheet 2
M3-!CS: port M3.!CS ; also sheet 2
M3-A-H: port M3.A-H ; also sheet 2
M3-A-L: port M3.A-L ; also sheet 2
M3-B-H: port M3.B-H ; also sheet 2
M3-B-L: port M3.B-L ; also sheet 2
M3-C-H: port M3.C-H ; also sheet 2
M3-C-L: port M3.C-L ; also sheet 2
M3-ENC-A: port M3.ENC-A ; also sheet 2
M3-ENC-B: port M3.ENC-B ; also sheet 2
M3-H1: port M3.H1 ; also sheet 2
M3-H2: port M3.H2 ; also sheet 2
M3-H3: port M3.H3 ; also sheet 2
M4-!CS: port M4.!CS ; also sheet 2
M4-A-H: port M4.A-H ; also sheet 2
M4-A-L: port M4.A-L ; also sheet 2
M4-B-H: port M4.B-H ; also sheet 2
M4-B-L: port M4.B-L ; also sheet 2
M4-C-H: port M4.C-H ; also sheet 2
M4-C-L: port M4.C-L ; also sheet 2
M4-ENC-A: port M4.ENC-A ; also sheet 2
M4-ENC-B: port M4.ENC-B ; also sheet 2
M4-H1: port M4.H1 ; also sheet 2
M4-H2: port M4.H2 ; also sheet 2
M4-H3: port M4.H3 ; also sheet 2
MISO-AUX: port M1.MISO M2.MISO DD.MISO M4.MISO M3.MISO ; also sheet 2
MOSI-AUX: port M1.MOSI M2.MOSI DD.MOSI M4.MOSI M3.MOSI ; also sheet 2
SCK-AUX: port M1.SCK M2.SCK DD.SCK M4.SCK M3.SCK ; also sheet 2

## Power pins joined to a net without a drawn wire
VB: KIT1.VB

## Library data of the parts
C1-C20 C28 C29 C31 C34 = resistor:C-US: CAPACITOR, American symbol
C21-C27 C30 C32 C33 C35 C36 = rcl:C-US: CAPACITOR, American symbol
D1 D6 D7 D10 = RoboJackets-LEDs:LED-SMD; DIGIKEY: 160-1446-1-ND; MPN: LTST-C191KGKT
D2 = RoboJackets-LEDs:LED-SMD; DIGIKEY: 160-1647-1-ND; MPN: LTST-C191TBKT
D3-D5 D8 D11-D15 = RoboJackets-LEDs:LED-SMD; DIGIKEY: 160-1447-1-ND; MPN: LTST-C191KRKT
D9 = RoboJackets-Diodes:DIODE-: DIODE
F1 = RoboJackets-Fuses:CHIP_FUSE
IC1 = RoboJackets-ICs:MCP23017: IO Expander 16bit I2C; DIGIKEY: MCP23017-E/SS-ND; MPN: MCP23017-E/SS
J1 = RoboJackets-Connectors:SBH11-*-D05-?; DIGIKEY: S9177-ND; MPN: SBH11-PBPC-D05-RA-BK
J2 J5 = RoboJackets-Connectors:3-PIN-HEADER; DIGIKEY: S7036-ND; MPN: PPPC031LFBN-RC
J3 = RoboJackets-Connectors:B2P?-VH(LF)(SN): Power Connector Brand: JST Sales America Inc. <https://www.jst.com/> Series: VH <http://www.digikey.com/product-search/en?FV=fff40016,fff802f3,ffec0e9d> Distributor: Digi-Key <http://www.digikey.com/product-detail/en/B2PS-VH%28LF%29%28SN%29/455-1648-ND/926555>; DIGIKEY: 455-1648-ND; MPN: B2PS-VH(LF)(SN)
J4 = RoboJackets-Connectors:HFW8; DIGIKEY: 609-1788-1-ND; MPN: HFW8R-1STE1LF
J6 = RoboJackets-Connectors:147721-3; DIGIKEY: A108812TR-ND; MPN: 147721-3
J7 = RoboJackets-Connectors:DF22-2; DIGIKEY: H125155-ND; MPN: DF22-2P-7.92DS(35)
KIT1 = RoboJackets-Boards:MBED_NXP_LPC1768: Mbed LPC1768 - ARM CORTEX v2.1 * Schematic symbol is now placed in eagles's default raster. *The pads diameter are suitable for routing between mbed pins * mbed pads are 0.8 mm drill diameter. --------------------------------------------- Created by: Mohamed Yousry *Alexandria, Egypt *Email: mohamed.yousry@ieeegoldegypt.org
LED1 LED2 = RoboJackets-LEDs:WS2812B: WS2812B 5050 RGB LED with Integrated Driver Chip http://www.adafruit.com/products/1655; DIGIKEY: 1528-1104-ND; MPN: 1655
R1-R9 R11-R14 R17 R24 = resistor:R-US_: RESISTOR, American symbol
R10 R15 R16 R18-R23 R25-R27 = rcl:R-US_: RESISTOR, American symbol
RN1-RN9 = RoboJackets-Resistors:RA-8: Resistor Array 8; DIGIKEY: 742C163331JPCT-ND; MPN: 742C163331JP
S1 = RoboJackets-Switches:94HCB16T: Rotary Hex Knob; DIGIKEY: GH7372-ND; MPN: 94HCB16T
S2 = switch-dil:219-03*: Surface Mount DIP Switch Series 219 SMT CTS Electronic Components Sourc: www.ctscorp.com; DIGIKEY: CT2193MST-ND; MPN: 219-3MST; OC_FARNELL: unknown; OC_NEWARK: unknown
S3 = RoboJackets-Switches:34EWMSP12M6RT; DIGIKEY: GH7540CT-ND; MPN: 34EWMSP12M6RT
SB1-SB4 = RoboJackets-Switches:SOLDERBRIDGE
U1 = RoboJackets-ICs:XC3S250E-4TQG144C: Spartan-3E 144pin; DIGIKEY: 122-1524-ND; MPN: XC3S250E-4TQG144C
U2 = RoboJackets-Sensors:MPU-6050; DIGIKEY: 1428-1007-1-ND; MPN: MPU-6050
U3 = RoboJackets-PowerICs:TLV70233; DIGIKEY: 296-32415-1-ND; MPN: TLV70233DBVR
U4 = RoboJackets-PowerICs:VND5E006ASPTR-E; DIGIKEY: 497-11623-1-ND; MPN: VND5E006ASPTR-E
U5 = RoboJackets-PowerICs:MCP1824T*?; DIGIKEY: MCP1824T-1202E/OTCT-ND; MPN: MCP1824T-1202E/OT; VOLTAGE: 1.2V
U6 = RoboJackets-PowerICs:MCP1824T*?; DIGIKEY: MCP1824T-2502E/OTCT-ND; MPN: MCP1824T-2502E/OT; VOLTAGE: 2.5V
U7 = RoboJackets-PowerICs:LMZ14201; DIGIKEY: LMZ14201HTZX/NOPBCT-ND; MPN: LMZ14201HTZX/NOPB
X1 = RoboJackets-FreqGen:ASV-*; DIGIKEY: 535-9314-1-ND; MPN: ASV-18.432MHZ-EJ-T
XF1 = RoboJackets-Fuses:3557-2; DIGIKEY: 36-3557-2-ND; MPN: 3557-2

## Module TEST
Ports: OUT[0..2](io)

### Library data of the parts

## Module WHEEL_DRIVE
Ports: A-H(io) A-L(io) B-H(io) B-L(io) C-H(io) C-L(io) !CS(io) !FAULT(io) !OCTW(io) +18.5V(io) +3V3(io) GND(io) MISO(io) MOSI(io) SCK(io) SO1(io) SO2(io) H1(io) H2(io) H3(io) ENC-A(io) ENC-B(io) +5V(io)
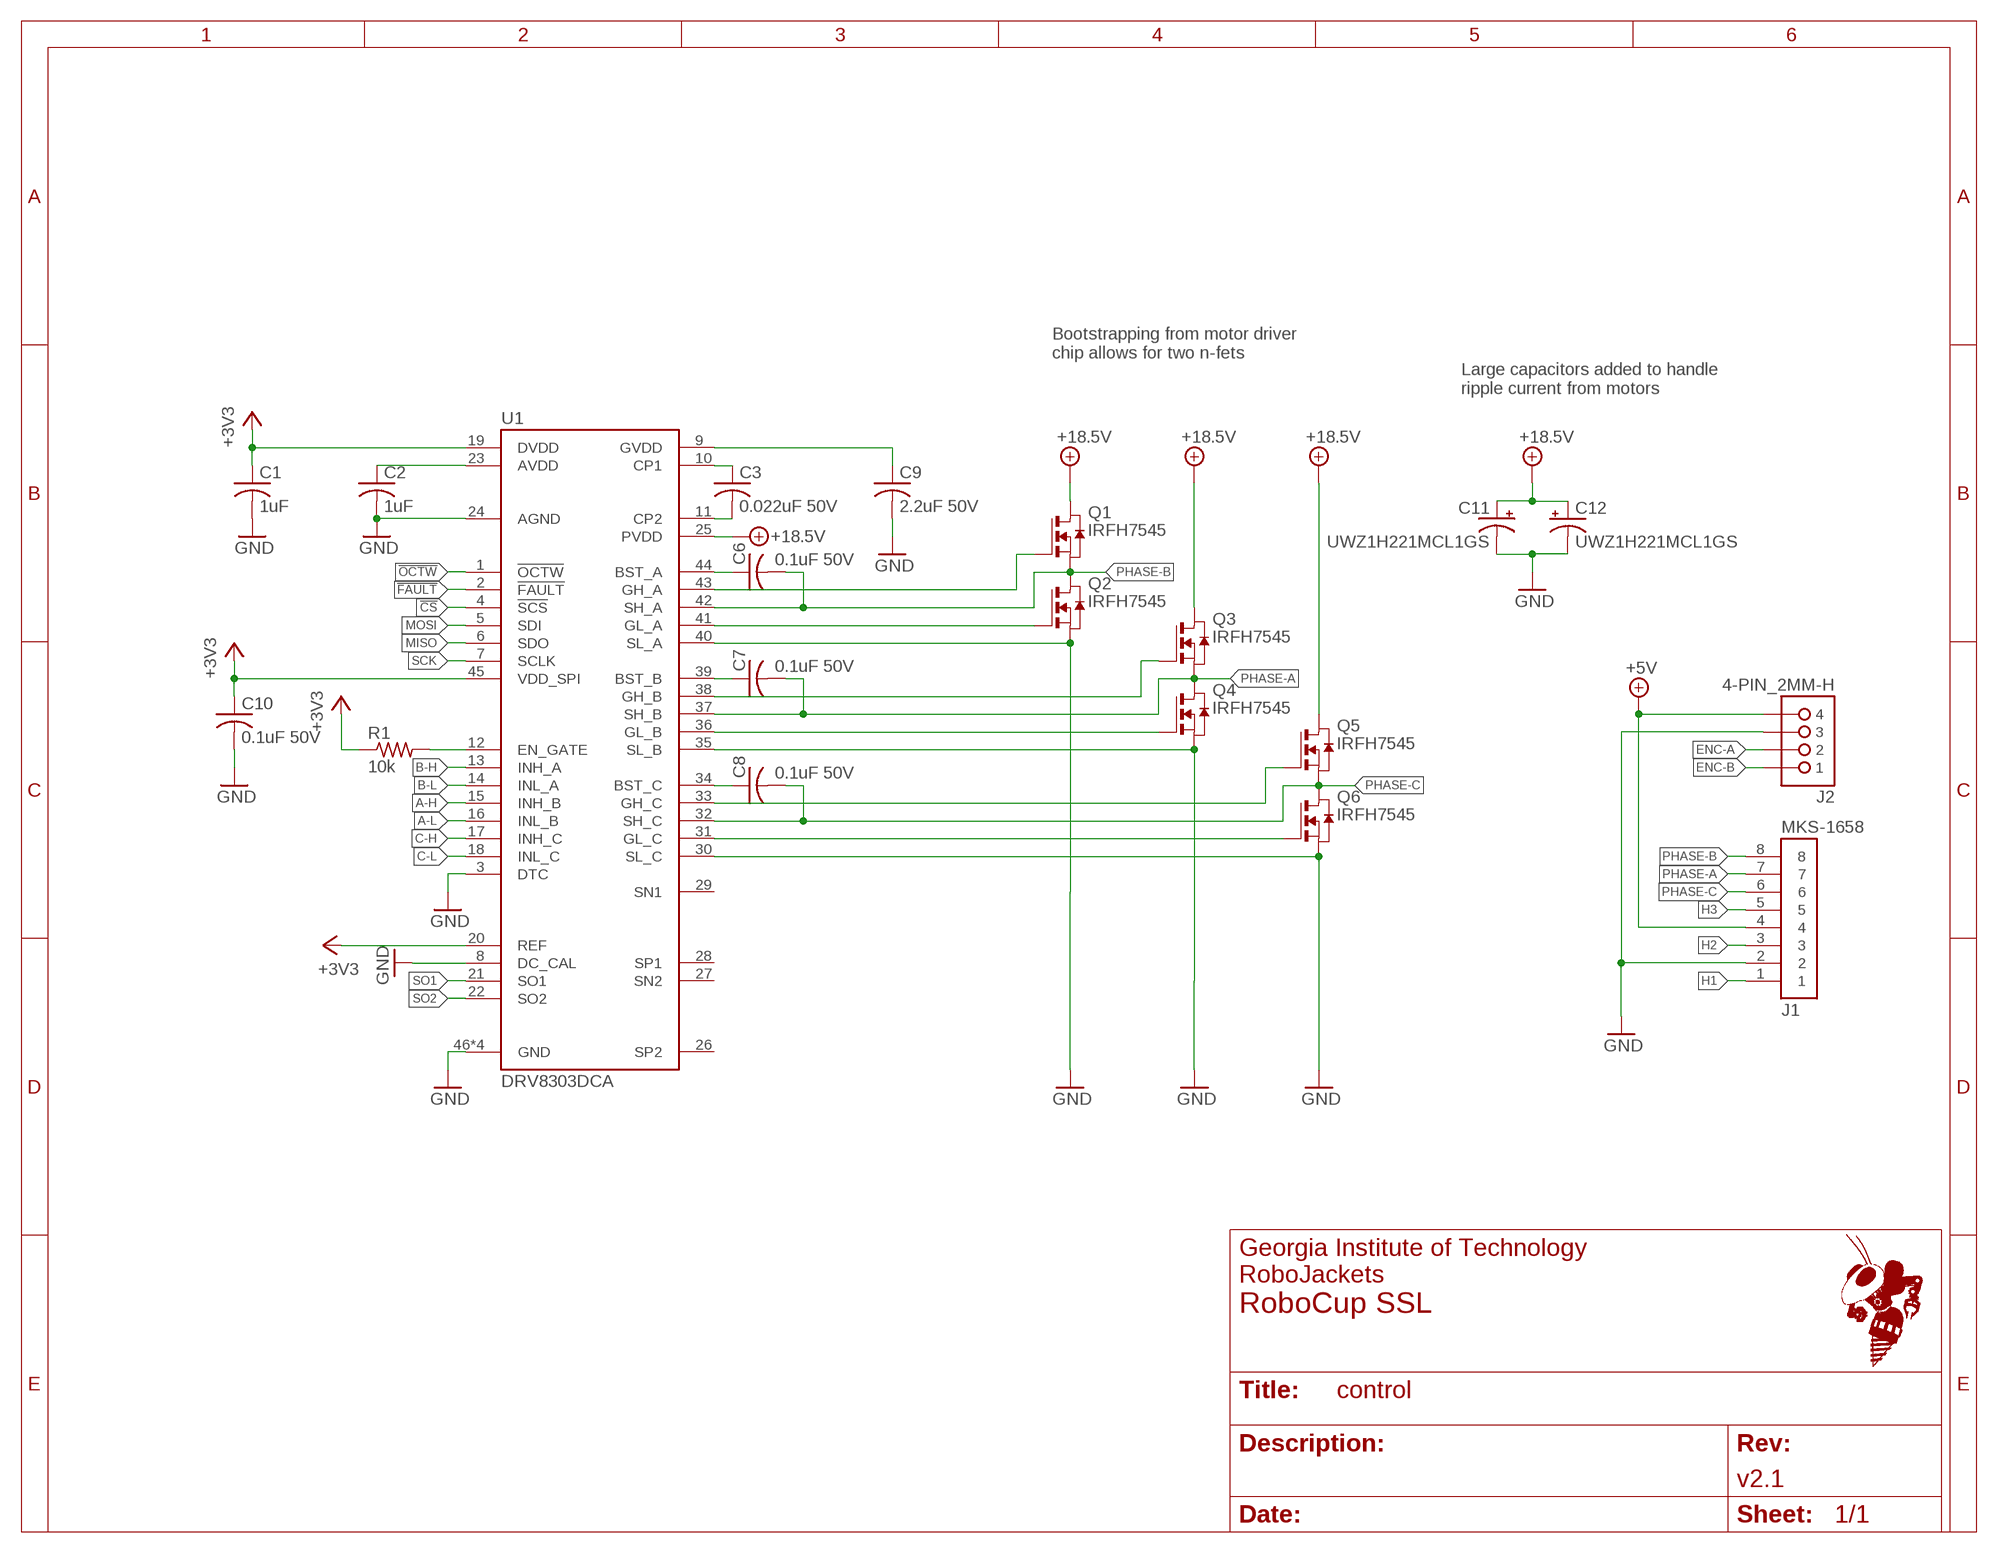
[diagram p5: schematic, module WHEEL_DRIVE, sheet 1]

### Parts
C1  1uF  C-USC0603  [C0603]
C2  1uF  C-USC0603  [C0603]
C3  0.022uF 50V  C-USC0603  [C0603]
C6  0.1uF 50V  C-USC0603  [C0603]
C7  0.1uF 50V  C-USC0603  [C0603]
C8  0.1uF 50V  C-USC0603  [C0603]
C9  2.2uF 50V  C-USC0603  [C0603]
C10  0.1uF 50V  C-USC0603  [C0603]
C11  UWZ1H221MCL1GS  [UWZ1H221MCL1GS]
C12  UWZ1H221MCL1GS  [UWZ1H221MCL1GS]
J1  MKS-1658  [MKS-1658]
J2  4-PIN_2MM-H  [2MM-4-H]
Q1  IRFH7545  [PQFN_5X6_E]
Q2  IRFH7545  [PQFN_5X6_E]
Q3  IRFH7545  [PQFN_5X6_E]
Q4  IRFH7545  [PQFN_5X6_E]
Q5  IRFH7545  [PQFN_5X6_E]
Q6  IRFH7545  [PQFN_5X6_E]
R1  10k  R-US_R0603  [R0603]
U1  DRV8303DCA  [TSSOP-48_PAD]

### Nets
!CS: U1.4(!SCS)
!FAULT: U1.2(!FAULT)
!OCTW: U1.1(!OCTW)
+3V3: C1.1 C10.1 R1.1 U1.19(DVDD) U1.20(REF) U1.45(VDD_SPI)
+5V: J1.4 J2.4
+18.5V: C11.1(+) C12.1(+) Q1.5678(D) Q3.5678(D) Q5.5678(D) U1.25(PVDD)
A-H: U1.15(INH_B)
A-L: U1.16(INL_B)
AVDD: C2.1 U1.23(AVDD)
B-H: U1.13(INH_A)
B-L: U1.14(INL_A)
BST-A: C6.1 U1.44(BST_A)
BST-B: C7.1 U1.39(BST_B)
BST-C: C8.1 U1.34(BST_C)
C-H: U1.17(INH_C)
C-L: U1.18(INL_C)
CP1: C3.1 U1.10(CP1)
CP2: C3.2 U1.11(CP2)
EN-GATE: R1.2 U1.12(EN_GATE)
ENC-A: J2.2
ENC-B: J2.1
GH-A: Q1.4(G) U1.43(GH_A)
GH-B: Q3.4(G) U1.38(GH_B)
GH-C: Q5.4(G) U1.33(GH_C)
GL-A: Q2.4(G) U1.41(GL_A)
GL-B: Q4.4(G) U1.36(GL_B)
GL-C: Q6.4(G) U1.31(GL_C)
GND: C1.2 C2.2 C9.2 C10.2 C11.2(-) C12.2(-) J1.2 J2.3 Q2.1(S) Q2.2(S) Q2.3(S) Q4.1(S) Q4.2(S) Q4.3(S) Q6.1(S) Q6.2(S) Q6.3(S) U1.3(DTC) U1.8(DC_CAL) U1.24(AGND) U1.30(SL_C) U1.35(SL_B) U1.40(SL_A) U1.46(GND) U1.47(GND) U1.48(GND) U1.PAD(GND)
GVDD: C9.1 U1.9(GVDD)
H1: J1.1
H2: J1.3
H3: J1.5
MISO: U1.6(SDO)
MOSI: U1.5(SDI)
PHASE-A: C7.2 J1.7 Q3.1(S) Q3.2(S) Q3.3(S) Q4.5678(D) U1.37(SH_B)
PHASE-B: C6.2 J1.8 Q1.1(S) Q1.2(S) Q1.3(S) Q2.5678(D) U1.42(SH_A)
PHASE-C: C8.2 J1.6 Q5.1(S) Q5.2(S) Q5.3(S) Q6.5678(D) U1.32(SH_C)
SCK: U1.7(SCLK)
SO1: U1.21(SO1)
SO2: U1.22(SO2)
Unconnected: U1.26(SP2) U1.27(SN2) U1.28(SP1) U1.29(SN1)

### Notes on the sheet
- Bootstrapping from motor driver
  chip allows for two n-fets
- Large capacitors added to handle
  ripple current from motors

### Library data of the parts
C1-C3 C6-C10 = rcl:C-US: CAPACITOR, American symbol
C11 C12 = RoboJackets-Capacitors:UWZ1H221MCL1GS; DIGIKEY: 493-9940-1-ND; MPN: UWZ1H221MCL1GS
J1 = RoboJackets-Connectors:MKS-1658; MPN: MKS 1658-6-0-808
J2 = RoboJackets-Connectors:4-PIN_2MM-*: MPN: 0353630460; DIGIKEY: WM18933-ND; MPN: 0353630460
Q1-Q6 = RoboJackets-Discrete:IRFH7545; DIGIKEY: IRFH7545TRPBFCT-ND; MPN: IRFH7545TRPBF
R1 = rcl:R-US_: RESISTOR, American symbol
U1 = RoboJackets-PowerICs:DRV8303; DIGIKEY: 296-40070-1-ND; MPN: DRV8303DCAR

## Module DRIBBLER_DRIVE
Ports: A-H(io) A-L(io) B-H(io) B-L(io) C-H(io) C-L(io) !CS(io) MISO(io) MOSI(io) SCK(io) GND(io) +3.3V(io) +18.5V(io) !FAULT(io) !OCTW(io) H1(io) H2(io) H3(io) +3V3(io)
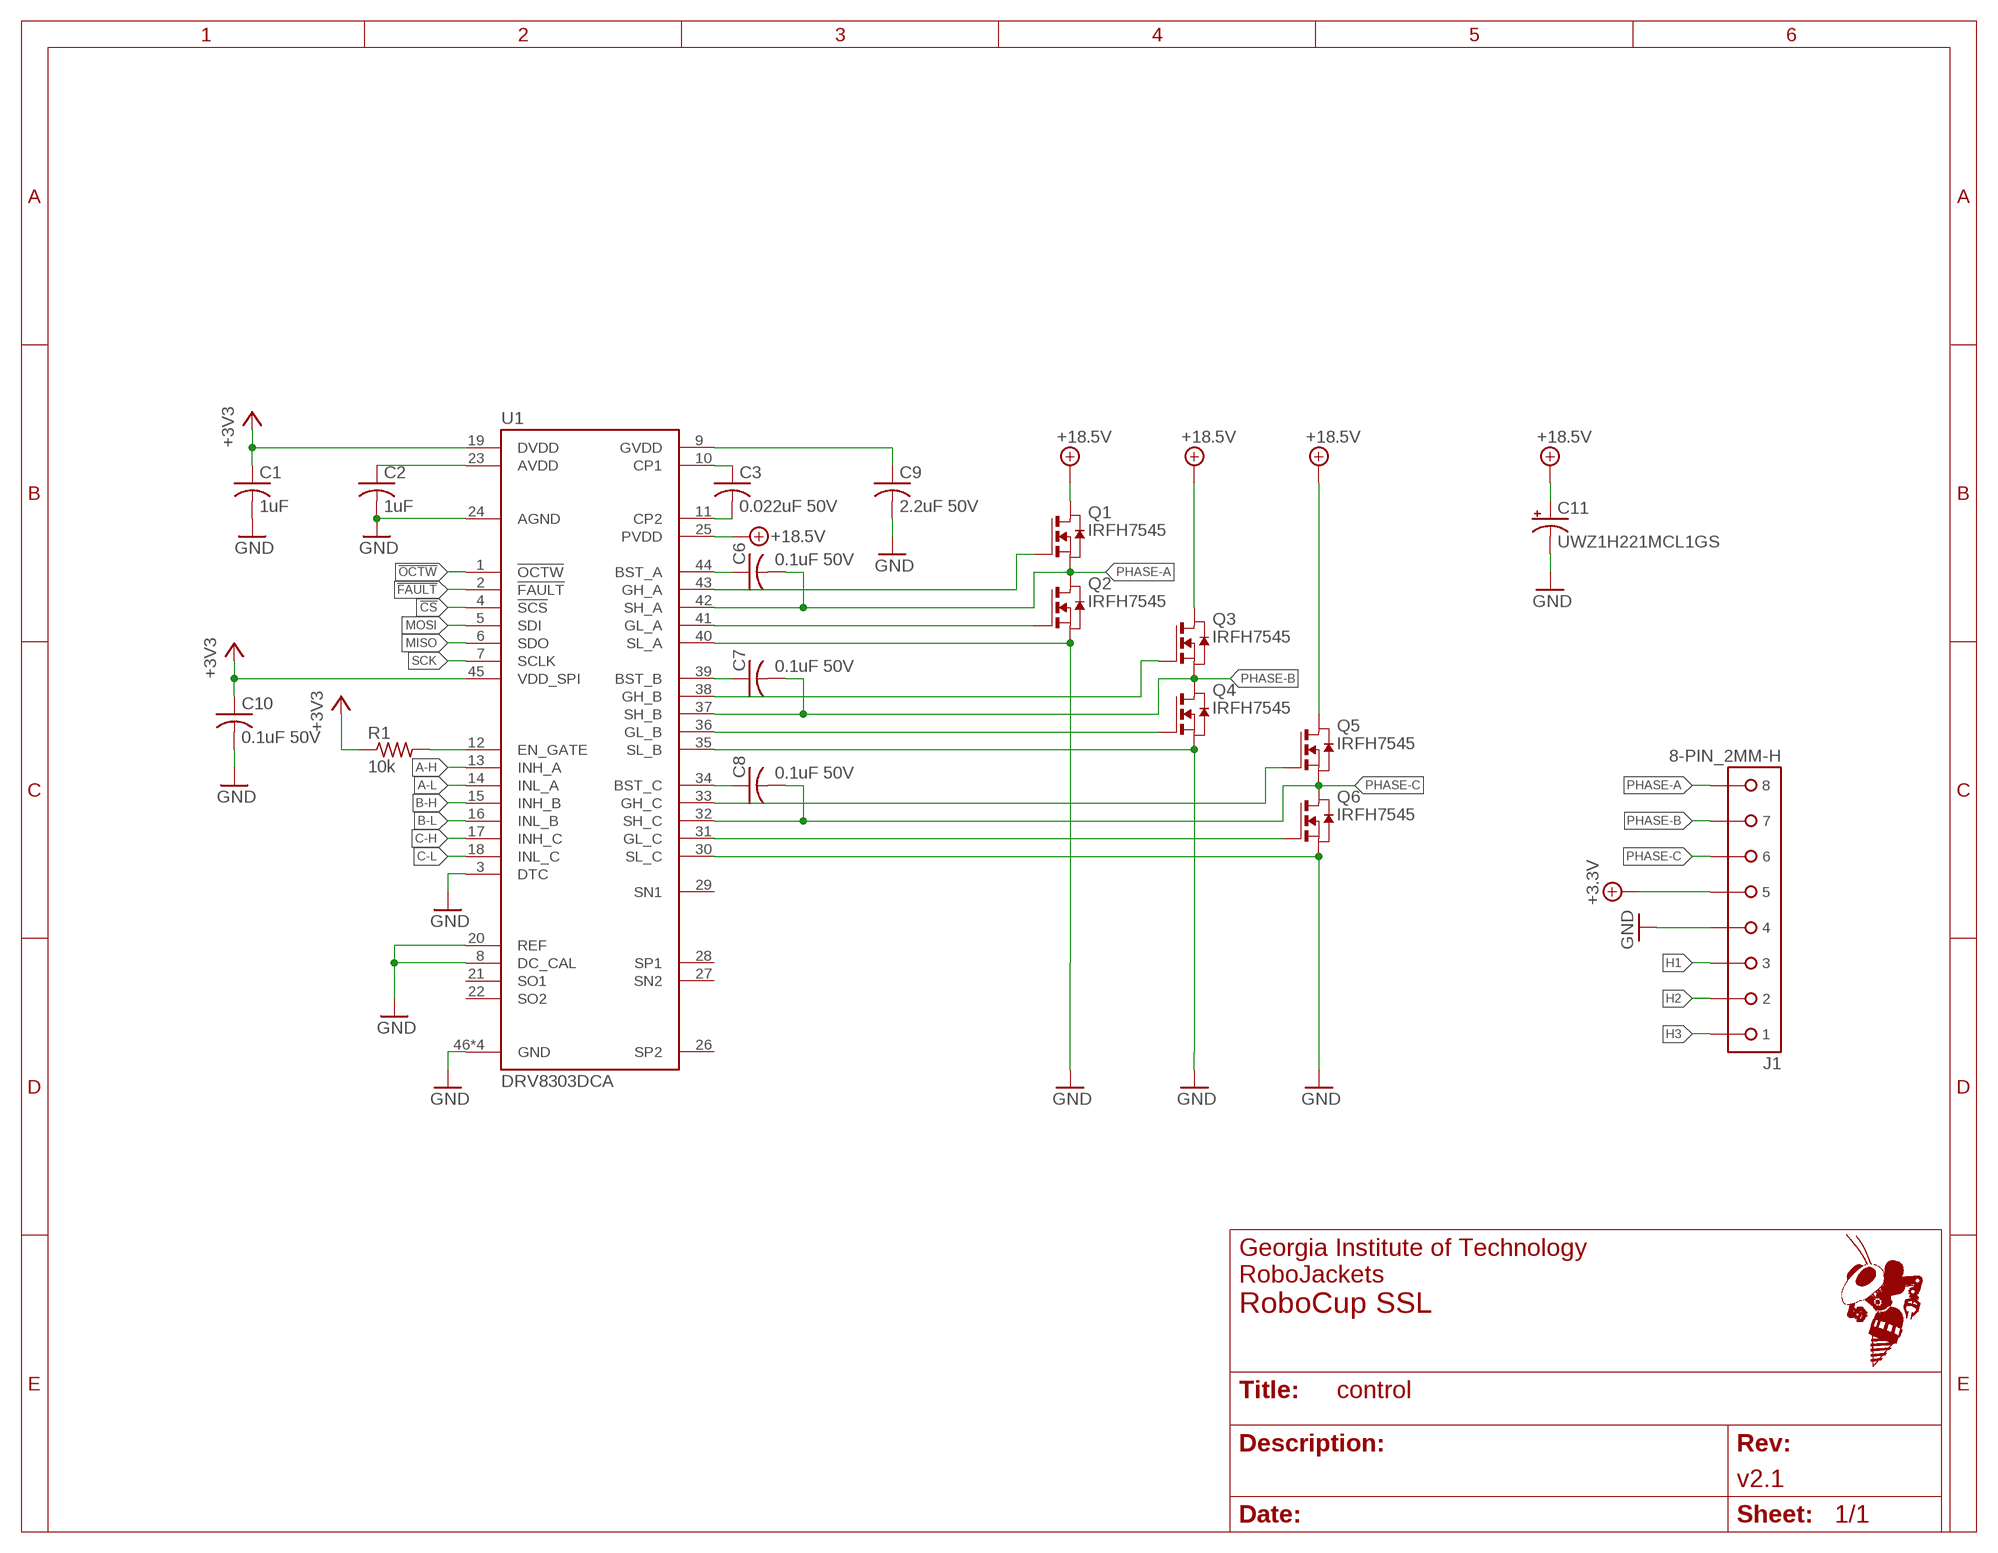
[diagram p6: schematic, module DRIBBLER_DRIVE, sheet 1]

### Parts
C1  1uF  C-USC0603  [C0603]
C2  1uF  C-USC0603  [C0603]
C3  0.022uF 50V  C-USC0603  [C0603]
C6  0.1uF 50V  C-USC0603  [C0603]
C7  0.1uF 50V  C-USC0603  [C0603]
C8  0.1uF 50V  C-USC0603  [C0603]
C9  2.2uF 50V  C-USC0603  [C0603]
C10  0.1uF 50V  C-USC0603  [C0603]
C11  UWZ1H221MCL1GS  [UWZ1H221MCL1GS]
J1  8-PIN_2MM-H  [2MM-8-H]
Q1  IRFH7545  [PQFN_5X6_E]
Q2  IRFH7545  [PQFN_5X6_E]
Q3  IRFH7545  [PQFN_5X6_E]
Q4  IRFH7545  [PQFN_5X6_E]
Q5  IRFH7545  [PQFN_5X6_E]
Q6  IRFH7545  [PQFN_5X6_E]
R1  10k  R-US_R0603  [R0603]
U1  DRV8303DCA  [TSSOP-48_PAD]

### Nets
!CS: U1.4(!SCS)
!FAULT: U1.2(!FAULT)
!OCTW: U1.1(!OCTW)
+3.3V: J1.5
+3V3: C1.1 C10.1 R1.1 U1.19(DVDD) U1.45(VDD_SPI)
+18.5V: C11.1(+) Q1.5678(D) Q3.5678(D) Q5.5678(D) U1.25(PVDD)
A-H: U1.13(INH_A)
A-L: U1.14(INL_A)
AVDD: C2.1 U1.23(AVDD)
B-H: U1.15(INH_B)
B-L: U1.16(INL_B)
BST-A: C6.1 U1.44(BST_A)
BST-B: C7.1 U1.39(BST_B)
BST-C: C8.1 U1.34(BST_C)
C-H: U1.17(INH_C)
C-L: U1.18(INL_C)
CP1: C3.1 U1.10(CP1)
CP2: C3.2 U1.11(CP2)
EN-GATE: R1.2 U1.12(EN_GATE)
GH-A: Q1.4(G) U1.43(GH_A)
GH-B: Q3.4(G) U1.38(GH_B)
GH-C: Q5.4(G) U1.33(GH_C)
GL-A: Q2.4(G) U1.41(GL_A)
GL-B: Q4.4(G) U1.36(GL_B)
GL-C: Q6.4(G) U1.31(GL_C)
GND: C1.2 C2.2 C9.2 C10.2 C11.2(-) J1.4 Q2.1(S) Q2.2(S) Q2.3(S) Q4.1(S) Q4.2(S) Q4.3(S) Q6.1(S) Q6.2(S) Q6.3(S) U1.3(DTC) U1.8(DC_CAL) U1.20(REF) U1.24(AGND) U1.30(SL_C) U1.35(SL_B) U1.40(SL_A) U1.46(GND) U1.47(GND) U1.48(GND) U1.PAD(GND)
GVDD: C9.1 U1.9(GVDD)
H1: J1.3
H2: J1.2
H3: J1.1
MISO: U1.6(SDO)
MOSI: U1.5(SDI)
PHASE-A: C6.2 J1.8 Q1.1(S) Q1.2(S) Q1.3(S) Q2.5678(D) U1.42(SH_A)
PHASE-B: C7.2 J1.7 Q3.1(S) Q3.2(S) Q3.3(S) Q4.5678(D) U1.37(SH_B)
PHASE-C: C8.2 J1.6 Q5.1(S) Q5.2(S) Q5.3(S) Q6.5678(D) U1.32(SH_C)
SCK: U1.7(SCLK)
Unconnected: U1.21(SO1) U1.22(SO2) U1.26(SP2) U1.27(SN2) U1.28(SP1) U1.29(SN1)

### Library data of the parts
C1-C3 C6-C10 = rcl:C-US: CAPACITOR, American symbol
C11 = RoboJackets-Capacitors:UWZ1H221MCL1GS; DIGIKEY: 493-9940-1-ND; MPN: UWZ1H221MCL1GS
J1 = RoboJackets-Connectors:8-PIN_2MM-*; DIGIKEY: WM18937-ND; MPN: 0353630860
Q1-Q6 = RoboJackets-Discrete:IRFH7545; DIGIKEY: IRFH7545TRPBFCT-ND; MPN: IRFH7545TRPBF
R1 = rcl:R-US_: RESISTOR, American symbol
U1 = RoboJackets-PowerICs:DRV8303; DIGIKEY: 296-40070-1-ND; MPN: DRV8303DCAR